# Altium project QCMI_SOM8MM.PrjPcb (part 2 of 3)

## Sheet 06-CPUCTL QCMI SOM.SchDoc: CPU MISC
size 431 x 279 mm; CAGE_CODE: 8LSW1; Designer: B. Jordan; DsnPath: G:\My Drive\Quilter Computer - Engineering Assets\NXP i.MX8M-Mini\8MMINILPD4-CPU2-DESIGNFILES\8MMINILPD4-CPU2-DESIGNFILES\SCH-47712_A4.DSN; ApprovedBy: S. Nesterenko; CheckedBy: D. Gudino; Author: B. Jordan; CompanyName: Allegro Labs, Inc.; DrawnBy: B. Jordan; Engineer: B. Jordan; Organization: QLTR; Address1: 29315 Stonecrest Rd; Address2: Rolling Hills Estates; Address3: CA, 90275; Address4: USA; DocumentNumber: QCMISM-SCH-06-0; Revision: 0; SheetNumber: 06; SheetTotal: 10; ENG_APP_DATE: --/--/--; DSN_APP_DATE: --/--/--; CHK_APP_DATE: --/--/--; DOC_NO_BOM: TBD; DOC_NO_ASSY_DWG: TBD; DOC_NO_FAB_DWG: TBD; DOC_NO_PCB_DWG: TBD
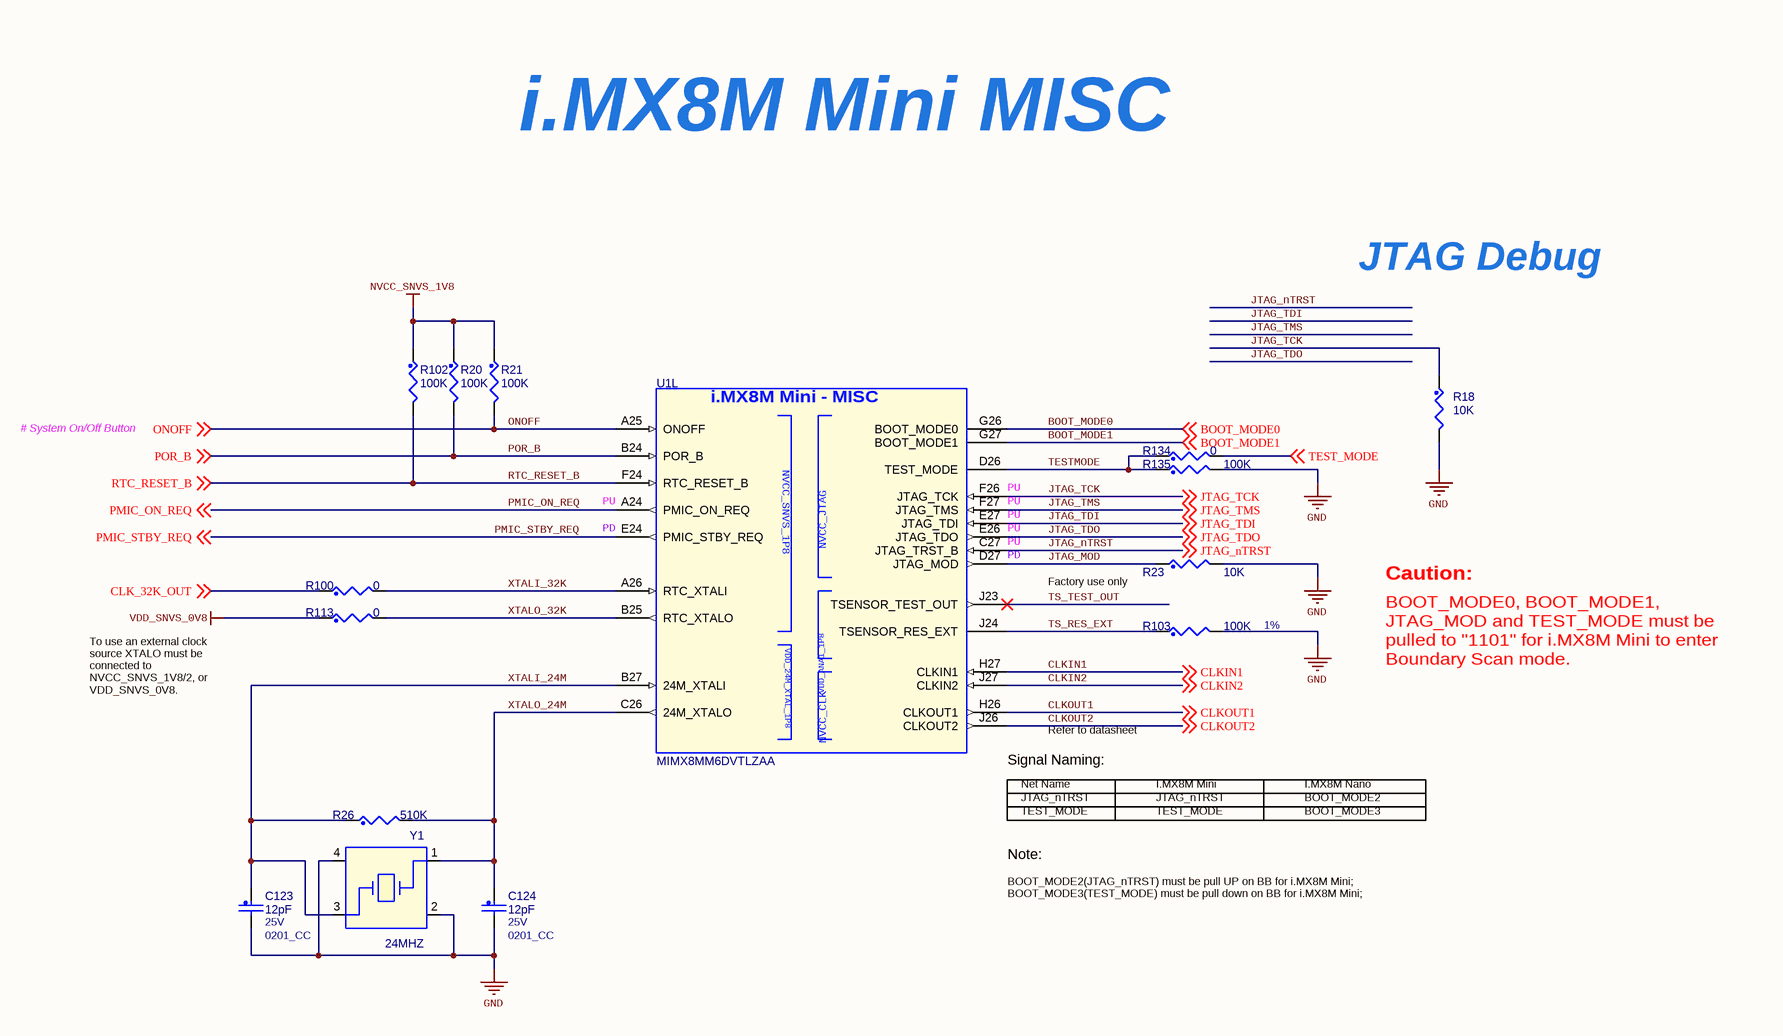
[diagram p5: 06-CPUCTL QCMI SOM.SchDoc]

### Parts
C123  12pF  VOLTAGE: 25V  [0201_CC]
C124  12pF  VOLTAGE: 25V  [0201_CC]
R18  10K  [0201_CC]
R20  100K  [0201_CC]
R21  100K  [0201_CC]
R23  10K  [0201_CC]
R26  510K  [0402_CC]
R100  0  [RC0402_25]
R102  100K  [0201_CC]
R103  100K  Tolerance: 1%  [0201_CC]
R113  0  [RC0402_25]
R134  0  [RC0402_25]
R135  100K  [0201_CC]
U1  MIMX8MM6DVTLZAA  [bga486_0p5_14x14]  (part L of 14)
Y1  24MHZ  [xtlosc4_3p2x2p5mm_sm]

### Nets
GND: C123.2 C124.2 R18.2 R23.2 R103.2 R135.2 Y1.2 Y1.4
NVCC_SNVS_1V8: R20.1 R21.1 R102.1
VDD_SNVS_0V8: R113.1
BOOT_MODE0: U1.G26(BOOT_MODE0) ; off-sheet BOOT_MODE0
BOOT_MODE1: U1.G27(BOOT_MODE1) ; off-sheet BOOT_MODE1
CLK_32K_OUT: R100.1 ; off-sheet CLK_32K_OUT
CLKIN1: U1.H27(CLKIN1) ; off-sheet CLKIN1
CLKIN2: U1.J27(CLKIN2) ; off-sheet CLKIN2
CLKOUT1: U1.H26(CLKOUT1) ; off-sheet CLKOUT1
CLKOUT2: U1.J26(CLKOUT2) ; off-sheet CLKOUT2
JTAG_MOD: R23.1 U1.D27(JTAG_MOD)
JTAG_nTRST: U1.C27(JTAG_TRST_B) ; off-sheet JTAG_nTRST
JTAG_TCK: R18.1 U1.F26(JTAG_TCK) ; off-sheet JTAG_TCK
JTAG_TDI: U1.E27(JTAG_TDI) ; off-sheet JTAG_TDI
JTAG_TDO: U1.E26(JTAG_TDO) ; off-sheet JTAG_TDO
JTAG_TMS: U1.F27(JTAG_TMS) ; off-sheet JTAG_TMS
ONOFF: R21.2 U1.A25(ONOFF) ; off-sheet ONOFF
PMIC_ON_REQ: U1.A24(PMIC_ON_REQ) ; off-sheet PMIC_ON_REQ
PMIC_STBY_REQ: U1.E24(PMIC_STBY_REQ) ; off-sheet PMIC_STBY_REQ
POR_B: R20.2 U1.B24(POR_B) ; off-sheet POR_B
RTC_RESET_B: R102.2 U1.F24(RTC_RESET_B) ; off-sheet RTC_RESET_B
TEST_MODE: R134.2 ; off-sheet TEST_MODE
TESTMODE: R134.1 R135.1 U1.D26(TEST_MODE)
TS_RES_EXT: R103.1 U1.J24(TSENSOR_RES_EXT)
TS_TEST_OUT: U1.J23(TSENSOR_TEST_OUT)
XTALI_24M: C123.1 R26.1 U1.B27(24M_XTALI) Y1.3
XTALI_32K: R100.2 U1.A26(RTC_XTALI)
XTALO_24M: C124.1 R26.2 U1.C26(24M_XTALO) Y1.1
XTALO_32K: R113.2 U1.B25(RTC_XTALO)

### Notes on the sheet
- i.MX8M Mini MISC
- JTAG Debug
- # System On/Off Button
- (near U1) PD
- (near U1) PU
- Factory use only
- Caution:
- BOOT_MODE0, BOOT_MODE1, JTAG_MOD and TEST_MODE must be pulled to "1101" for i.MX8M Mini to enter Boundary Scan mode.
- To use an external clock source XTALO must be connected to NVCC_SNVS_1V8/2, or VDD_SNVS_0V8.
- Refer to datasheet
- (near U1) Signal Naming:
- Net Name
- JTAG_nTRST
- I.MX8M Mini
- I.MX8M Nano
- BOOT_MODE2
- Note:
- TEST_MODE
- BOOT_MODE3
- BOOT_MODE2(JTAG_nTRST) must be pull UP on BB for i.MX8M Mini;
  BOOT_MODE3(TEST_MODE) must be pull down on BB for i.MX8M Mini;
- DWG. NO.
- REV.
- SHT.
- REVISION
- DESCRIPTION
- DATE
- APPROVED
- ENG:
- APPROVALS
- REFERENCE DOCUMENTS
- DSN:
- CHK:
- TITLE
- PROJECT
- BOM:
- ASSY DWG:
- FAB DWG:
- SIZE
- FILE NAME
- B
- SCHEMATIC DOCUMENT NUMBER
- SHEET
- OF
- REV
- PCB DWG:
- (in symbol MIMX8MM_BGA486P, part L) i.MX8M Mini - MISC; VDD_ANA1_1P8

### Library data of the parts
C123 = CAP_NP: CAP CER 12PF 25V 5% C0G AEC-Q200 0201; MFG_NAME01: TDK; MFG_PN01: CGA1A2C0G1E120J030BA; EIA Case: 0201; Temp Range: -55°C ~ 125°C; Value: 12pF; Tolerance: 5%; ROHS: Yes; PCB Footprint: 0201_CC
C124 = CAP_NP: CAP CER 12PF 25V 5% C0G AEC-Q200 0201; MFG_PN01: CGA1A2C0G1E120J030BA; MFG_NAME01: TDK; EIA Case: 0201; Temp Range: -55°C ~ 125°C; Value: 12pF; ROHS: Yes; Tolerance: 5%; PCB Footprint: 0201_CC
R18 = RES: RES MF 10K 1/20W 5% 0201; MFG_NAME01: RALEC ELECTRONIC CORP; MFG_PN01: RTT01103JTH; EIA Case: 0201; Temp Range: -55°C ~ 125°C; Value: 10K; Tolerance: 5%; ROHS: Yes; PCB Footprint: 0201_CC; Rated Power: 1/20W
R20 R21 R102 R103 = RES: RES MF 100K 1/20W 1% 0201; MFG_PN01: RC-0201-104FT; MFG_NAME01: SKYMOS; EIA Case: 0201; Temp Range: -55°C ~ 125°C; Value: 100K; ROHS: Yes; PCB Footprint: 0201_CC; Rated Power: 1/20W
  R20 R21 R102: Tolerance: 1%
R23 = RES: RES MF 10K 1/20W 5% 0201; MFG_PN01: RTT01103JTH; MFG_NAME01: RALEC ELECTRONIC CORP; EIA Case: 0201; Temp Range: -55°C ~ 125°C; Value: 10K; ROHS: Yes; Tolerance: 5%; PCB Footprint: 0201_CC; Rated Power: 1/20W
R26 = RES: RES MF 510K 1/16W 5% 0402; MFG_NAME01: PANASONIC; MFG_PN01: ERJ-2GEJ514X; EIA Case: 0402; Value: 510K; Tolerance: 5%; ROHS: Yes; PCB Footprint: 0402_CC; Rated Power: 1/16W
R100 = RES: RES MF ZERO OHM 1/16W 5% 0402; EIA Case: 0402; MFG_PN01: MCR01MZPJ000; MFG_NAME01: ROHM; Value: 0; ROHS: Yes; Tolerance: 5%; PCB Footprint: RC0402_25; Rated Power: 1/16W
R113 R134 = RES: RES MF ZERO OHM 1/16W 5% 0402; EIA Case: 0402; MFG_NAME01: ROHM; MFG_PN01: MCR01MZPJ000; Value: 0; Tolerance: 5%; ROHS: Yes; PCB Footprint: RC0402_25; Rated Power: 1/16W
R135 = RES: RES MF 100K 1/20W 1% 0201; MFG_NAME01: SKYMOS; MFG_PN01: RC-0201-104FT; EIA Case: 0201; Temp Range: -55°C ~ 125°C; Value: 100K; Tolerance: 1%; ROHS: Yes; PCB Footprint: 0201_CC; Rated Power: 1/20W
U1 = MIMX8MM_BGA486P: IC CPU QUAD CORTEX A53+M4 1.8GHZ BGA486; MFG_NAME01: NXP SEMICONDUCTORS; Value: MIMX8MM6DVTLZAA; MFG_PN01: MIMX8MM6DVTLZAA; ROHS: Yes; PCB Footprint: bga486_0p5_14x14; JEDEC Case: BGA486
Y1 = XTAL_13Y: XTAL 24MHZ 9pF -- SMT 3.2X2.5MM; MFG_PN01: TSX-3225 24.0000MF15X-AC3; MFG_NAME01: EPSON TOYOCOM CORPORATION; EIA Case: 3225 (Metric); Value: 24MHZ; ROHS: Yes; PCB Footprint: xtlosc4_3p2x2p5mm_sm

## Sheet 07-FLASH QCMI SOM.SchDoc: eMMC/QSPI
size 431 x 279 mm; CAGE_CODE: 8LSW1; Designer: B. Jordan; DsnPath: G:\My Drive\Quilter Computer - Engineering Assets\NXP i.MX8M-Mini\8MMINILPD4-CPU2-DESIGNFILES\8MMINILPD4-CPU2-DESIGNFILES\SCH-47712_A4.DSN; ApprovedBy: S. Nesterenko; CheckedBy: D. Gudino; Author: B. Jordan; CompanyName: Allegro Labs, Inc.; DrawnBy: B. Jordan; Engineer: B. Jordan; Organization: QLTR; Address1: 29315 Stonecrest Rd; Address2: Rolling Hills Estates; Address3: CA, 90275; Address4: USA; DocumentNumber: QCMISM-SCH-07-0; Revision: 0; SheetNumber: 07; SheetTotal: 10; ENG_APP_DATE: --/--/--; DSN_APP_DATE: --/--/--; CHK_APP_DATE: --/--/--; DOC_NO_BOM: TBD; DOC_NO_ASSY_DWG: TBD; DOC_NO_FAB_DWG: TBD; DOC_NO_PCB_DWG: TBD
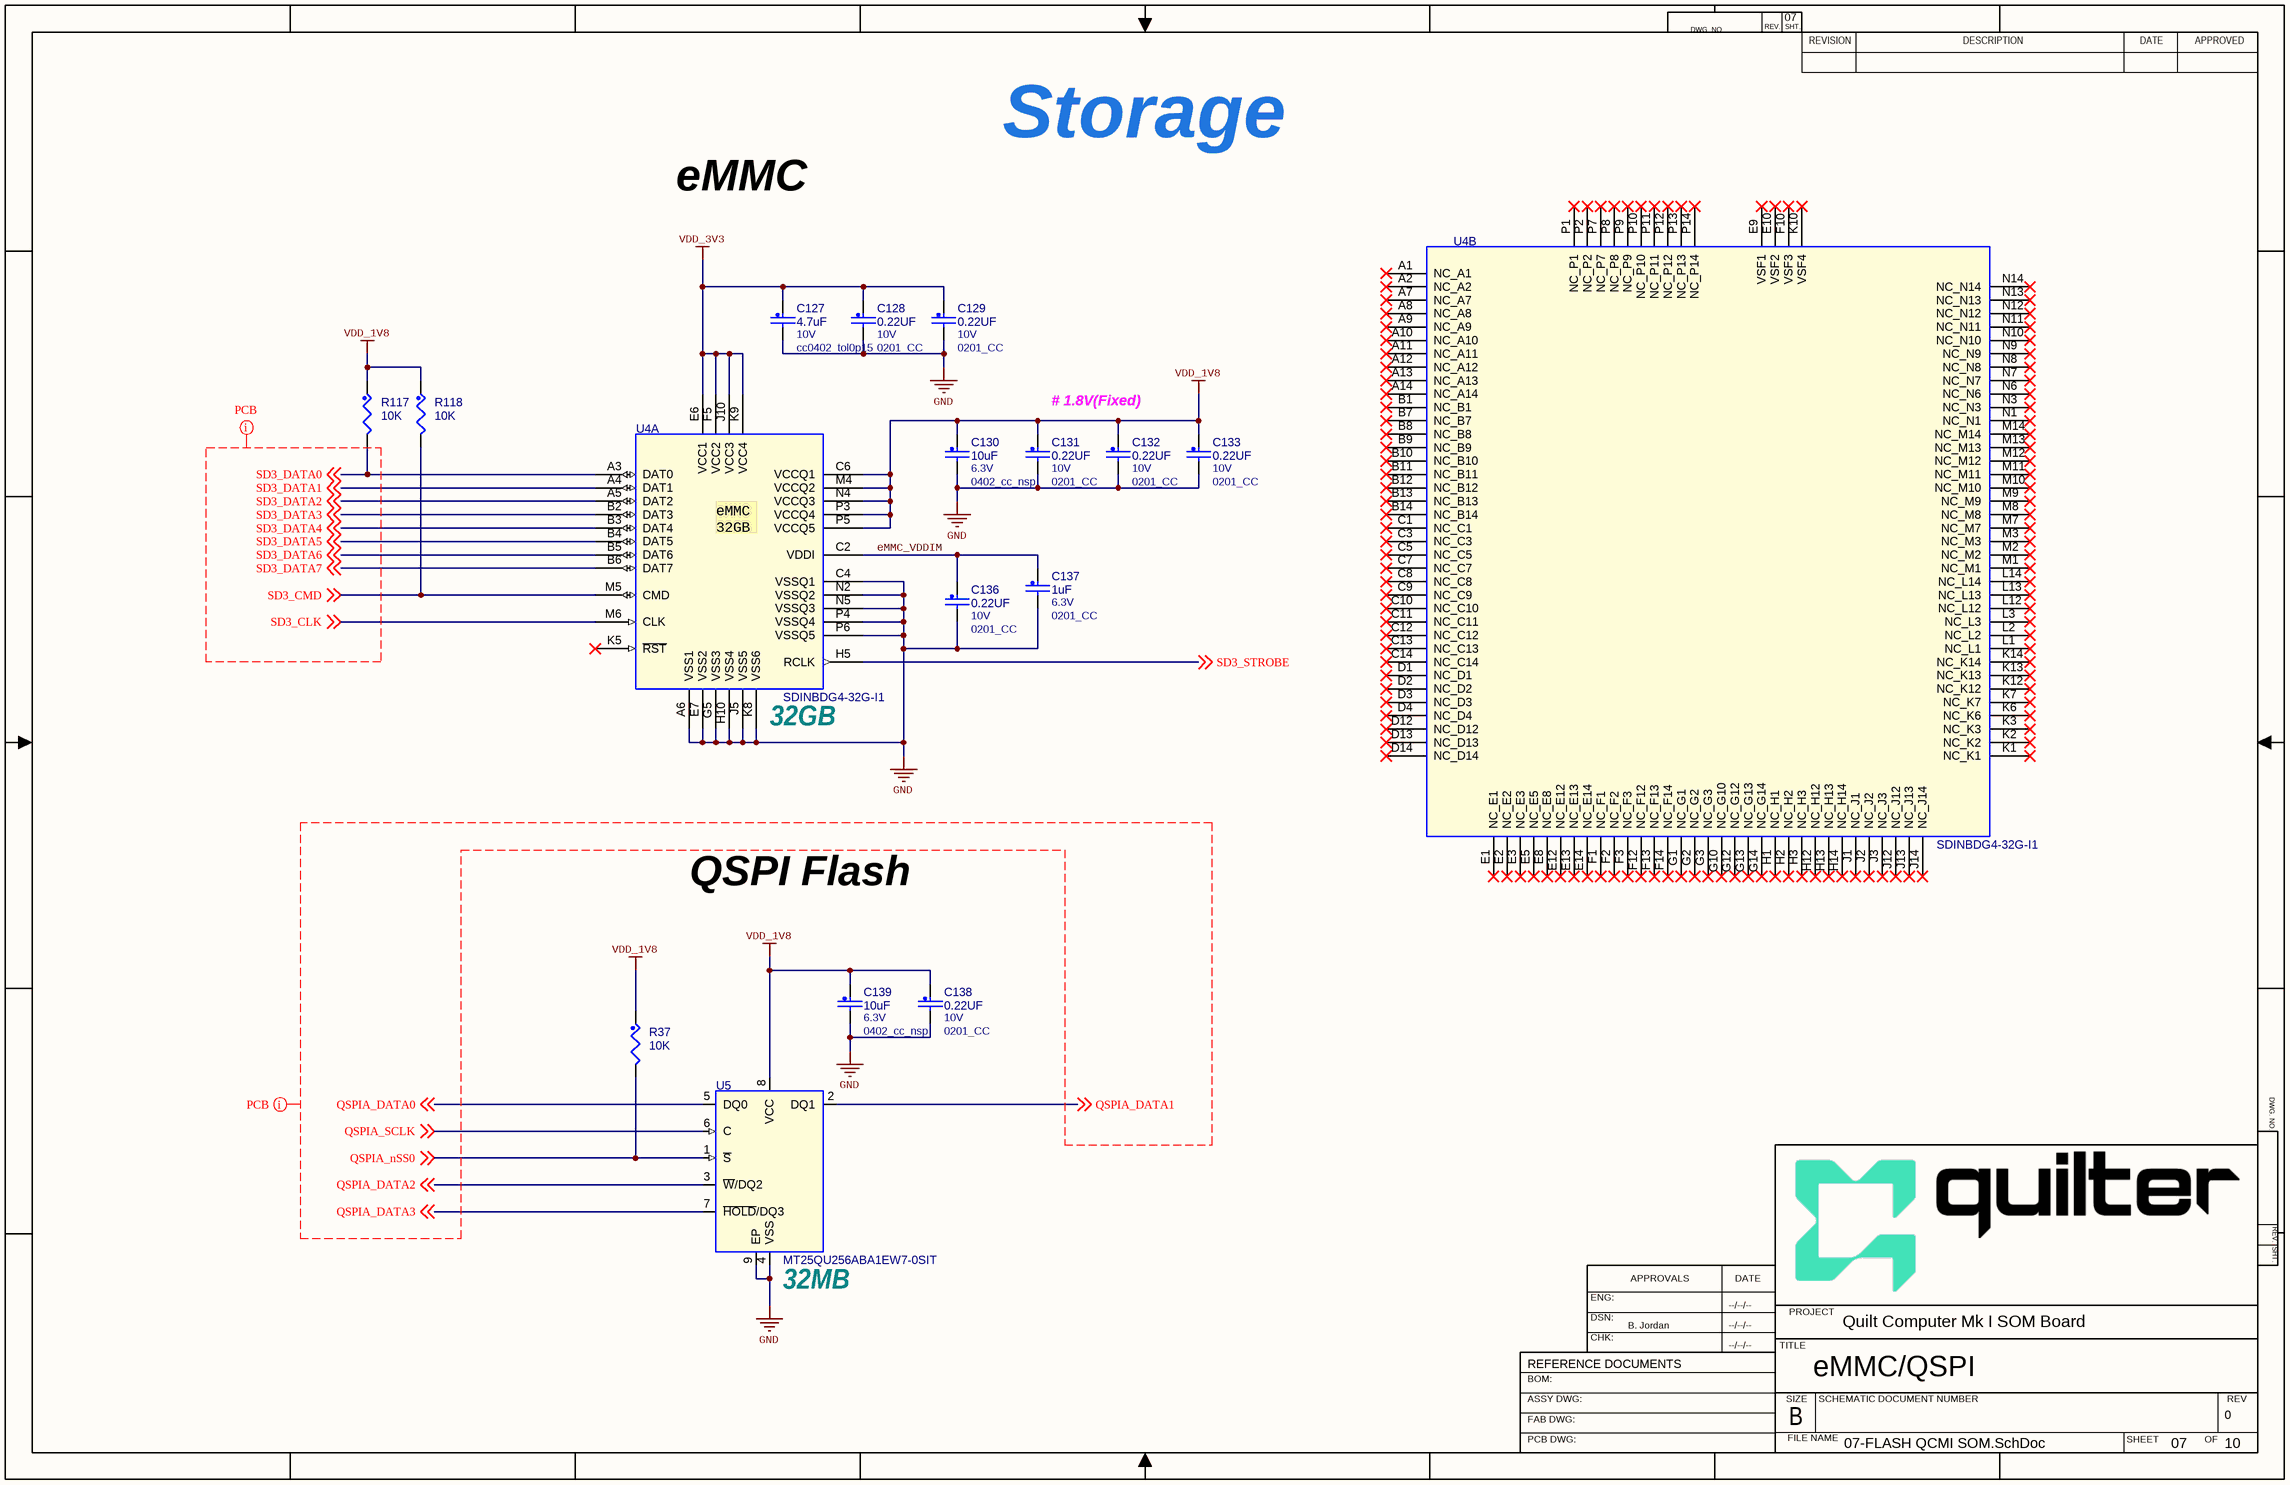
[diagram p6: 07-FLASH QCMI SOM.SchDoc]

### Parts
C127  4.7uF  VOLTAGE: 10V  [cc0402_tol0p15]
C128  0.22UF  VOLTAGE: 10V  [0201_CC]
C129  0.22UF  VOLTAGE: 10V  [0201_CC]
C130  10uF  VOLTAGE: 6.3V  [0402_cc_nsp]
C131  0.22UF  VOLTAGE: 10V  [0201_CC]
C132  0.22UF  VOLTAGE: 10V  [0201_CC]
C133  0.22UF  VOLTAGE: 10V  [0201_CC]
C136  0.22UF  VOLTAGE: 10V  [0201_CC]
C137  1uF  VOLTAGE: 6.3V  [0201_CC]
C138  0.22UF  VOLTAGE: 10V  [0201_CC]
C139  10uF  VOLTAGE: 6.3V  [0402_cc_nsp]
R37  10K  [0402_CC]
R117  10K  [0201_CC]
R118  10K  [0201_CC]
U4  SDINBDG4-32G-I1  [fbga153_0p5_11p5x13]  (parts A,B of 2)
U5  MT25QU256ABA1EW7-0SIT  [dfn8_1p27_6x5mm_3p1]

### Nets
GND: C127.2 C128.2 C129.2 C130.2 C131.2 C132.2 C133.2 C136.2 C137.2 C138.2 C139.2 U4.A6(VSS1) U4.C4(VSSQ1) U4.E7(VSS2) U4.G5(VSS3) U4.H10(VSS4) U4.J5(VSS5) U4.K8(VSS6) U4.N2(VSSQ2) U4.N5(VSSQ3) U4.P4(VSSQ4) U4.P6(VSSQ5) U5.4(VSS) U5.9(EP)
VDD_1V8: C130.1 C131.1 C132.1 C133.1 C138.1 C139.1 R37.1 R117.1 R118.1 U4.C6(VCCQ1) U4.M4(VCCQ2) U4.N4(VCCQ3) U4.P3(VCCQ4) U4.P5(VCCQ5) U5.8(VCC)
VDD_3V3: C127.1 C128.1 C129.1 U4.E6(VCC1) U4.F5(VCC2) U4.J10(VCC3) U4.K9(VCC4)
eMMC_VDDIM: C136.1 C137.1 U4.C2(VDDI)
QSPIA_DATA0: U5.5(DQ0) ; off-sheet QSPIA_DATA0
QSPIA_DATA1: U5.2(DQ1) ; off-sheet QSPIA_DATA1
QSPIA_DATA2: U5.3(~{W}/DQ2) ; off-sheet QSPIA_DATA2
QSPIA_DATA3: U5.7(~{HOLD}/DQ3) ; off-sheet QSPIA_DATA3
QSPIA_nSS0: R37.2 U5.1(~{S}) ; off-sheet QSPIA_nSS0
QSPIA_SCLK: U5.6(C) ; off-sheet QSPIA_SCLK
SD3_CLK: U4.M6(CLK) ; off-sheet SD3_CLK
SD3_CMD: R118.2 U4.M5(CMD) ; off-sheet SD3_CMD
SD3_DATA0: R117.2 U4.A3(DAT0) ; off-sheet SD3_DATA0
SD3_DATA1: U4.A4(DAT1) ; off-sheet SD3_DATA1
SD3_DATA2: U4.A5(DAT2) ; off-sheet SD3_DATA2
SD3_DATA3: U4.B2(DAT3) ; off-sheet SD3_DATA3
SD3_DATA4: U4.B3(DAT4) ; off-sheet SD3_DATA4
SD3_DATA5: U4.B4(DAT5) ; off-sheet SD3_DATA5
SD3_DATA6: U4.B5(DAT6) ; off-sheet SD3_DATA6
SD3_DATA7: U4.B6(DAT7) ; off-sheet SD3_DATA7
SD3_STROBE: U4.H5(RCLK) ; off-sheet SD3_STROBE

Not connected (* = marked no-connect by the designer): U4 A1(NC_A1)* A2(NC_A2)* A7(NC_A7)* A8(NC_A8)* A9(NC_A9)* A10(NC_A10)* A11(NC_A11)* A12(NC_A12)* A13(NC_A13)* A14(NC_A14)* B1(NC_B1)* B7(NC_B7)* B8(NC_B8)* B9(NC_B9)* B10(NC_B10)* B11(NC_B11)* B12(NC_B12)* B13(NC_B13)* B14(NC_B14)* C1(NC_C1)* C3(NC_C3)* C5(NC_C5)* C7(NC_C7)* C8(NC_C8)* C9(NC_C9)* C10(NC_C10)* C11(NC_C11)* C12(NC_C12)* C13(NC_C13)* C14(NC_C14)* D1(NC_D1)* D2(NC_D2)* D3(NC_D3)* D4(NC_D4)* D12(NC_D12)* D13(NC_D13)* D14(NC_D14)* E1(NC_E1)* E2(NC_E2)* E3(NC_E3)* E5(NC_E5)* E8(NC_E8)* E9(VSF1)* E10(VSF2)* E12(NC_E12)* E13(NC_E13)* E14(NC_E14)* F1(NC_F1)* F2(NC_F2)* F3(NC_F3)* F10(VSF3)* F12(NC_F12)* F13(NC_F13)* F14(NC_F14)* G1(NC_G1)* G2(NC_G2)* G3(NC_G3)* G10(NC_G10)* G12(NC_G12)* G13(NC_G13)* G14(NC_G14)* H1(NC_H1)* H2(NC_H2)* H3(NC_H3)* H12(NC_H12)* H13(NC_H13)* H14(NC_H14)* J1(NC_J1)* J2(NC_J2)* J3(NC_J3)* J12(NC_J12)* J13(NC_J13)* J14(NC_J14)* K1(NC_K1)* K2(NC_K2)* K3(NC_K3)* K5(~{RST})* K6(NC_K6)* K7(NC_K7)* K10(VSF4)* K12(NC_K12)* K13(NC_K13)* K14(NC_K14)* L1(NC_L1)* L2(NC_L2)* L3(NC_L3)* L12(NC_L12)* L13(NC_L13)* L14(NC_L14)* M1(NC_M1)* M2(NC_M2)* M3(NC_M3)* M7(NC_M7)* M8(NC_M8)* M9(NC_M9)* M10(NC_M10)* M11(NC_M11)* M12(NC_M12)* M13(NC_M13)* M14(NC_M14)* N1(NC_N1)* N3(NC_N3)* N6(NC_N6)* N7(NC_N7)* N8(NC_N8)* N9(NC_N9)* N10(NC_N10)* N11(NC_N11)* N12(NC_N12)* N13(NC_N13)* N14(NC_N14)* P1(NC_P1)* P2(NC_P2)* P7(NC_P7)* P8(NC_P8)* P9(NC_P9)* P10(NC_P10)* P11(NC_P11)* P12(NC_P12)* P13(NC_P13)* P14(NC_P14)*

### Layout directives
net class EMMC_SD3; rule Matched Net Lengths [Delay Tolerance = 100ps]: SD3_CLK, SD3_CMD, SD3_DATA0, SD3_DATA1, SD3_DATA2, SD3_DATA3, SD3_DATA4, SD3_DATA5, SD3_DATA6, SD3_DATA7
net class QSPI; rule Matched Net Lengths [Delay Tolerance = 100ps]: QSPIA_DATA0, QSPIA_DATA1, QSPIA_DATA2, QSPIA_DATA3, QSPIA_nSS0, QSPIA_SCLK

### Notes on the sheet
- Storage
- eMMC
- # 1.8V(Fixed)
- (near U4) 32GB
- QSPI Flash
- (near U5) 32MB
- DWG. NO.
- REV.
- SHT.
- REVISION
- DESCRIPTION
- DATE
- APPROVED
- ENG:
- APPROVALS
- REFERENCE DOCUMENTS
- DSN:
- CHK:
- TITLE
- PROJECT
- BOM:
- ASSY DWG:
- FAB DWG:
- SIZE
- FILE NAME
- B
- SCHEMATIC DOCUMENT NUMBER
- SHEET
- OF
- REV
- PCB DWG:
- (in symbol SDINBDG4-16G_VFBGA_153P, part A) eMMC / 32GB

### Library data of the parts
C127 = CAP_NP: CAP CER 4.7uF 10V 10% X5R 0402; MFG_NAME01: SAMSUNG ELECTRO MECHANICS; MFG_PN01: CL05A475KP5NRNC; EIA Case: 0402; Temp Range: -55°C ~ 125°C; Value: 4.7uF; Tolerance: 10%; ROHS: Yes; PCB Footprint: cc0402_tol0p15
C128 C131-C133 = CAP_NP: CAP CER 0.22UF 10V 20% X5R 0201; MFG_NAME01: Taiyo Yuden; MFG_PN01: LMK063BJ224MP-F; EIA Case: 0201; Temp Range: -55°C ~ 125°C; Value: 0.22UF; PCB Footprint: 0201_CC; Tolerance: 20%; ROHS: Yes
C129 C136 C138 = CAP_NP: CAP CER 0.22UF 10V 20% X5R 0201; MFG_PN01: LMK063BJ224MP-F; MFG_NAME01: Taiyo Yuden; EIA Case: 0201; Temp Range: -55°C ~ 125°C; Value: 0.22UF; PCB Footprint: 0201_CC; ROHS: Yes; Tolerance: 20%
C130 = CAP_NP: CAP CER 10UF 6.3V 20% X5R 0402; MFG_NAME01: SAMSUNG ELECTRO MECHANICS; MFG_PN01: CL05A106MQ5NUNC; EIA Case: 0402; Temp Range: -55°C ~ 125°C; Value: 10uF; Tolerance: 20%; ROHS: Yes; PCB Footprint: 0402_cc_nsp
C137 = CAP_NP: CAP CER 1uF 6.3V 20% X5R 0201; MFG_NAME01: AVX; MFG_PN01: 02016D105MAT2A; EIA Case: 0201; Temp Range: -55°C ~ 125°C; Value: 1uF; PCB Footprint: 0201_CC; Tolerance: 20%; ROHS: Yes
C139 = CAP_NP: CAP CER 10UF 6.3V 20% X5R 0402; MFG_PN01: CL05A106MQ5NUNC; MFG_NAME01: SAMSUNG ELECTRO MECHANICS; EIA Case: 0402; Temp Range: -55°C ~ 125°C; Value: 10uF; ROHS: Yes; Tolerance: 20%; PCB Footprint: 0402_cc_nsp
R37 = RES: RES MF 10K 1/16W 5% 0402; MFG_NAME01: VISHAY INTERTECHNOLOGY; MFG_PN01: CRCW040210K0JNED; EIA Case: 0402; Value: 10K; PCB Footprint: 0402_CC; Tolerance: 5%; ROHS: Yes; Rated Power: 1/16W
R117 R118 = RES: RES MF 10K 1/20W 5% 0201; MFG_PN01: RTT01103JTH; MFG_NAME01: RALEC ELECTRONIC CORP; EIA Case: 0201; Value: 10K; PCB Footprint: 0201_CC; ROHS: Yes; Tolerance: 5%; Rated Power: 1/20W
U4 = SDINBDG4-16G_VFBGA_153P: IC MEM NAND FLASH 32GB eMMC 5.1 CTLR 2.7-3.6V FBGA153; EIA Case: 11.5 mm x 13 mm x 1 mm; Temp Range: -25°C ~ 85°C; MFG_NAME01: SanDisk; JEDEC Case: BGA153; Value: SDINBDG4-32G-I1; PCB Footprint: fbga153_0p5_11p5x13; ROHS: YES; VOLTAGE: 2.7-3.6V; MFG_PN01: SDINBDG4-32G-I1
U5 = MT25QL256ABA1EW9_9P: IC MEM FLASH SERIAL NOR 256MBIT 166MHZ 1.7-2V WPDFN8; MFG_NAME01: MICRON; Value: MT25QU256ABA1EW7-0SIT; PCB Footprint: dfn8_1p27_6x5mm_3p1; MFG_PN01: MT25QU256ABA1EW7-0SIT; ROHS: Yes; VOLTAGE: 1.7-2V

## Sheet 08-BOOTCFG QMCI SOM.SchDoc: BOOT_CFG
size 558 x 431 mm; CAGE_CODE: 8LSW1; Designer: B. Jordan; DsnPath: G:\My Drive\Quilter Computer - Engineering Assets\NXP i.MX8M-Mini\8MMINILPD4-CPU2-DESIGNFILES\8MMINILPD4-CPU2-DESIGNFILES\SCH-47712_A4.DSN; ApprovedBy: S. Nesterenko; CheckedBy: D. Gudino; Author: B. Jordan; CompanyName: Allegro Labs, Inc.; DrawnBy: B. Jordan; Engineer: B. Jordan; Address1: 29315 Stonecrest Rd; Address2: Rolling Hills Estates; Address3: CA, 90275; Address4: USA; DocumentNumber: QCMISM-SCH-08-0; Revision: 0; SheetNumber: 08; SheetTotal: 10; CHK_APP_DATE: --/--/--; DSN_APP_DATE: --/--/--; ENG_APP_DATE: --/--/--; DOC_NO_BOM: TBD; DOC_NO_ASSY_DWG: TBD; DOC_NO_FAB_DWG: TBD; DOC_NO_PCB_DWG: TBD
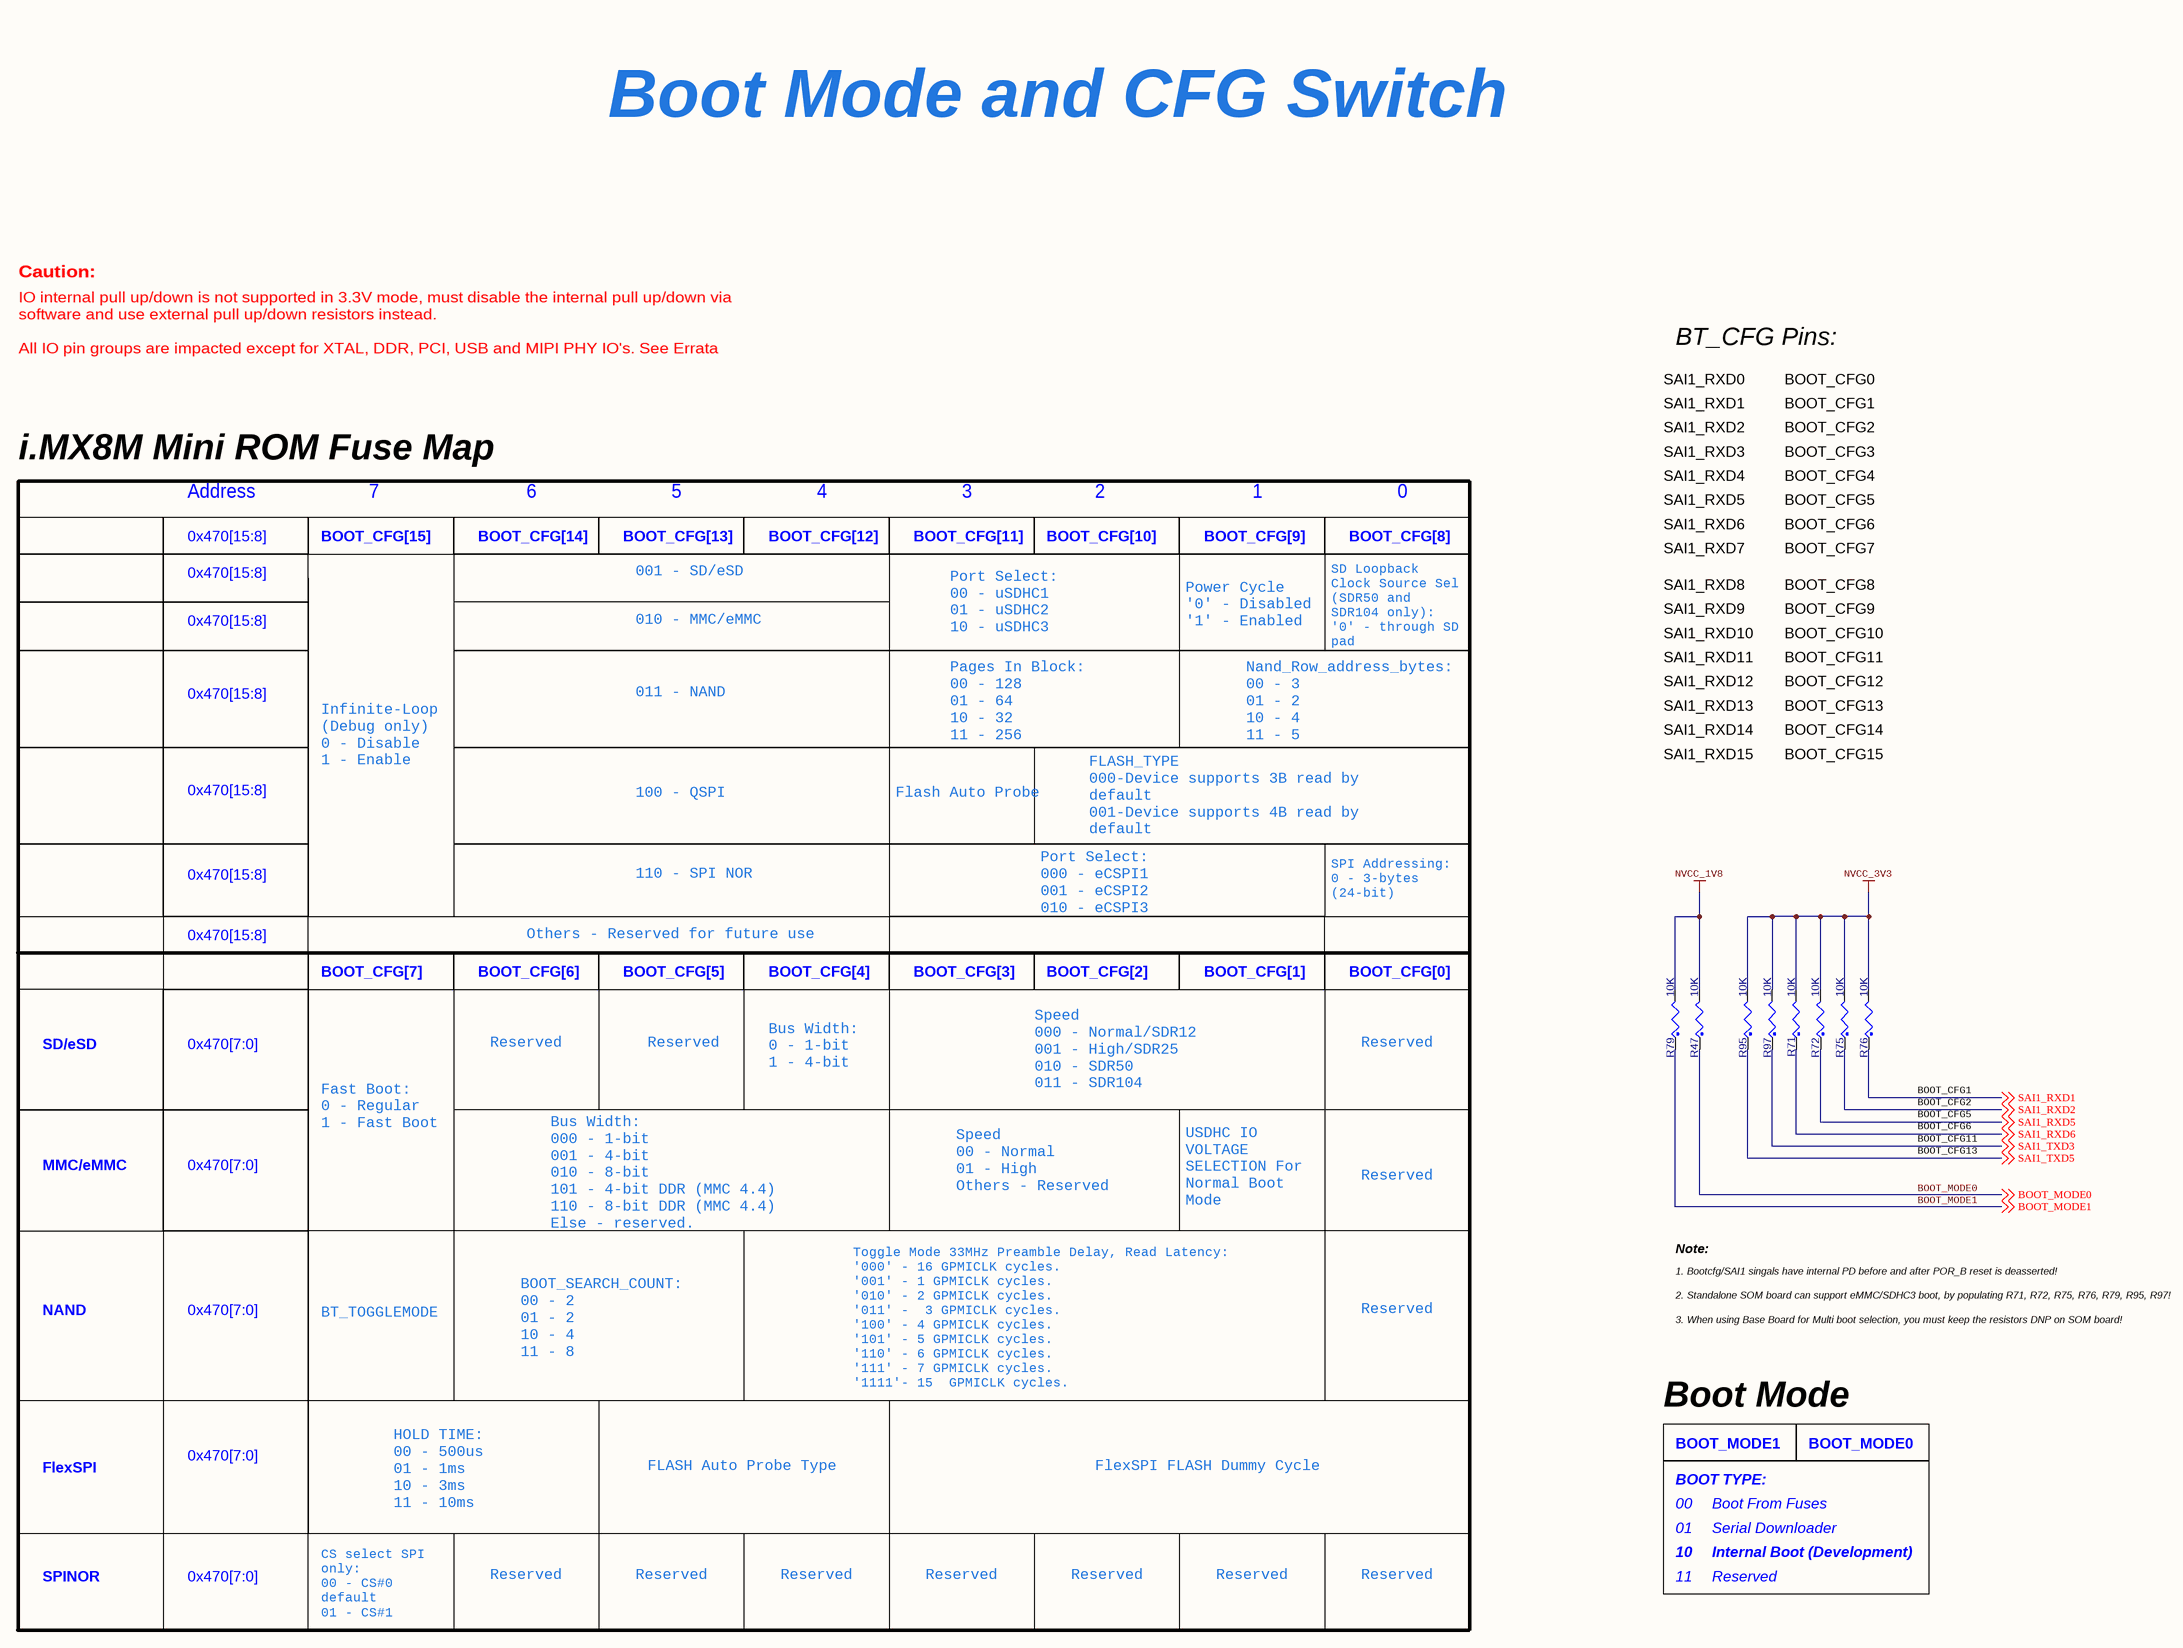
[diagram p7: 08-BOOTCFG QMCI SOM.SchDoc]

### Parts
R47  10K  [0402_CC]
R71  10K  [0402_CC]
R72  10K  [0402_CC]
R75  10K  [0402_CC]
R76  10K  [0402_CC]
R79  10K  [0402_CC]
R95  10K  [0402_CC]
R97  10K  [0402_CC]

### Nets
NVCC_1V8: R47.2 R79.2  [project net VDD_1V8]
NVCC_3V3: R71.2 R72.2 R75.2 R76.2 R95.2 R97.2  [project net VDD_3V3]
BOOT_MODE0: R47.1 ; off-sheet BOOT_MODE0
BOOT_MODE1: R79.1 ; off-sheet BOOT_MODE1
SAI1_RXD1: R76.1 ; off-sheet SAI1_RXD1
SAI1_RXD2: R75.1 ; off-sheet SAI1_RXD2
SAI1_RXD5: R72.1 ; off-sheet SAI1_RXD5
SAI1_RXD6: R71.1 ; off-sheet SAI1_RXD6
SAI1_TXD3: R97.1 ; off-sheet SAI1_TXD3
SAI1_TXD5: R95.1 ; off-sheet SAI1_TXD5

### Notes on the sheet
- Boot Mode and CFG Switch
- Caution:
- IO internal pull up/down is not supported in 3.3V mode, must disable the internal pull up/down via software and use external pull up/down resistors instead.
  All IO pin groups are impacted except for XTAL, DDR, PCI, USB and MIPI PHY IO's. See Errata e50080 for detailed information.
- BT_CFG Pins:
- SAI1_RXD0
- SAI1_RXD1
- BOOT_CFG0
- BOOT_CFG1
- i.MX8M Mini ROM Fuse Map
- SAI1_RXD2
- SAI1_RXD3
- SAI1_RXD4
- BOOT_CFG2
- BOOT_CFG3
- BOOT_CFG4
- 0x470[15:8]
- Address
- BOOT_CFG[15]
- 7
- BOOT_CFG[14]
- 6
- BOOT_CFG[13]
- 5
- BOOT_CFG[12]
- 4
- BOOT_CFG[11]
- 3
- BOOT_CFG[10]
- 2
- BOOT_CFG[9]
- 1
- BOOT_CFG[8]
- 0
- SAI1_RXD5
- SAI1_RXD6
- BOOT_CFG5
- BOOT_CFG6
- 001 - SD/eSD
- SAI1_RXD7
- SAI1_RXD8
- BOOT_CFG7
- BOOT_CFG8
- 010 - MMC/eMMC
- Port Select:
  00 - uSDHC1
  01 - uSDHC2
  10 - uSDHC3
- Power Cycle
  '0' - Disabled
  '1' - Enabled
- SD Loopback Clock Source Sel (SDR50 and SDR104 only):
  '0' - through SD pad
  '1' -  direct
- SAI1_RXD9
- SAI1_RXD10
- SAI1_RXD11
- BOOT_CFG9
- BOOT_CFG10
- BOOT_CFG11
- 011 - NAND
- SAI1_RXD12
- SAI1_RXD13
- BOOT_CFG12
- BOOT_CFG13
- Infinite-Loop
  (Debug only)
  0 - Disable
  1 - Enable
- Pages In Block:
  00 - 128
  01 - 64
  10 - 32
  11 - 256
- Nand_Row_address_bytes:
  00 - 3
  01 - 2
  10 - 4
  11 - 5
- SAI1_RXD14
- SAI1_RXD15
- BOOT_CFG14
- BOOT_CFG15
- 100 - QSPI
- Flash Auto Probe
- FLASH_TYPE
  000-Device supports 3B read by default
  001-Device supports 4B read by default
  010-HyperFlash 1V8
  011-HyperFlash 3V3
  100-MXIC Octal DDR
- 110 - SPI NOR
- Others - Reserved for future use
- Port Select:
  000 - eCSPI1
  001 - eCSPI2
  010 - eCSPI3
- SPI Addressing:
  0 - 3-bytes (24-bit)
  1 - 2-bytes (16-bit)
- BOOT_CFG[7]
- BOOT_CFG[6]
- BOOT_CFG[5]
- BOOT_CFG[4]
- BOOT_CFG[3]
- BOOT_CFG[2]
- BOOT_CFG[1]
- BOOT_CFG[0]
- SD/eSD
- 0x470[7:0]
- Reserved
- Bus Width:
  0 - 1-bit
  1 - 4-bit
- Speed
  000 - Normal/SDR12
  001 - High/SDR25
  010 - SDR50
  011 - SDR104
  Others - Reserved
- Fast Boot:
  0 - Regular
  1 - Fast Boot
- MMC/eMMC
- Bus Width:
  000 - 1-bit
  001 - 4-bit
  010 - 8-bit
  101 - 4-bit DDR (MMC 4.4)
  110 - 8-bit DDR (MMC 4.4)
  Else - reserved.
- Speed
  00 - Normal
  01 - High
  Others - Reserved
- USDHC IO VOLTAGE
  SELECTION For
  Normal Boot Mode
  0 - 3.3V
  1 - 1.8V
- Note:
- NAND
- BT_TOGGLEMODE
- 1. Bootcfg/SAI1 singals have internal PD before and after POR_B reset is deasserted!
- 2. Standalone SOM board can support eMMC/SDHC3 boot, by populating R71, R72, R75, R76, R79, R95, R97!
- 3. When using Base Board for Multi boot selection, you must keep the resistors DNP on SOM board!
- BOOT_SEARCH_COUNT:
  00 - 2
  01 - 2
  10 - 4
  11 - 8
- Toggle Mode 33MHz Preamble Delay, Read Latency:
  '000' - 16 GPMICLK cycles.
  '001' - 1 GPMICLK cycles.
  '010' - 2 GPMICLK cycles.
  '011' -  3 GPMICLK cycles.
  '100' - 4 GPMICLK cycles.
  '101' - 5 GPMICLK cycles.
  '110' - 6 GPMICLK cycles.
  '111' - 7 GPMICLK cycles.
  '1111'- 15  GPMICLK cycles.
- Boot Mode
- BOOT_MODE1
- BOOT_MODE0
- FlexSPI
- FLASH Auto Probe Type
- FlexSPI FLASH Dummy Cycle
- 00
- BOOT TYPE:
- Boot From Fuses
- HOLD TIME:
  00 - 500us
  01 - 1ms
  10 - 3ms
  11 - 10ms
- 01
- 10
- Serial Downloader
- Internal Boot (Development)
- SPINOR
- CS select SPI only:
  00 - CS#0  default
  01 - CS#1
  10 - CS#2
  11 - CS#3
- 11
- DWG. NO.
- REV.
- SHT.
- REVISION
- DESCRIPTION
- DATE
- APPROVED
- ENG:
- DSN:
- APPROVALS
- PROJECT
- REFERENCE DOCUMENTS
- BOM:
- CHK:
- TITLE
- ASSY DWG:
- FAB DWG:
- PCB DWG:
- SIZE
- FILE NAME
- C
- SCHEMATIC DOCUMENT NUMBER
- SHEET
- OF
- REV

### Library data of the parts
R47 R71 R75 = RES: RES MF 10K 1/16W 5% 0402; MFG_PN01: CRCW040210K0JNED; MFG_NAME01: VISHAY INTERTECHNOLOGY; EIA Case: 0402; Value: 10K; PCB Footprint: 0402_CC; ROHS: Yes; Tolerance: 5%; Rated Power: 1/16W
R72 R76 R79 R95 R97 = RES: as R37 on sheet 07-FLASH QCMI SOM; Value: 10K; PCB Footprint: 0402_CC; Tolerance: 5%; ROHS: Yes; Rated Power: 1/16W

## Sheet 09-PMIC QCMI SOM.SchDoc: PMIC
size 558 x 431 mm; CAGE_CODE: 8LSW1; Designer: B. Jordan; DsnPath: G:\My Drive\Quilter Computer - Engineering Assets\NXP i.MX8M-Mini\8MMINILPD4-CPU2-DESIGNFILES\8MMINILPD4-CPU2-DESIGNFILES\SCH-47712_A4.DSN; ApprovedBy: S. Nesterenko; CheckedBy: D. Gudino; Author: B. Jordan; CompanyName: Allegro Labs, Inc.; DrawnBy: B. Jordan; Engineer: B. Jordan; Address1: 29315 Stonecrest Rd; Address2: Rolling Hills Estates; Address3: CA, 90275; Address4: USA; DocumentNumber: QCMISM-SCH-09-0; Revision: 0; SheetNumber: 09; SheetTotal: 10; CHK_APP_DATE: --/--/--; DSN_APP_DATE: --/--/--; ENG_APP_DATE: --/--/--; DOC_NO_BOM: TBD; DOC_NO_ASSY_DWG: TBD; DOC_NO_FAB_DWG: TBD; DOC_NO_PCB_DWG: TBD
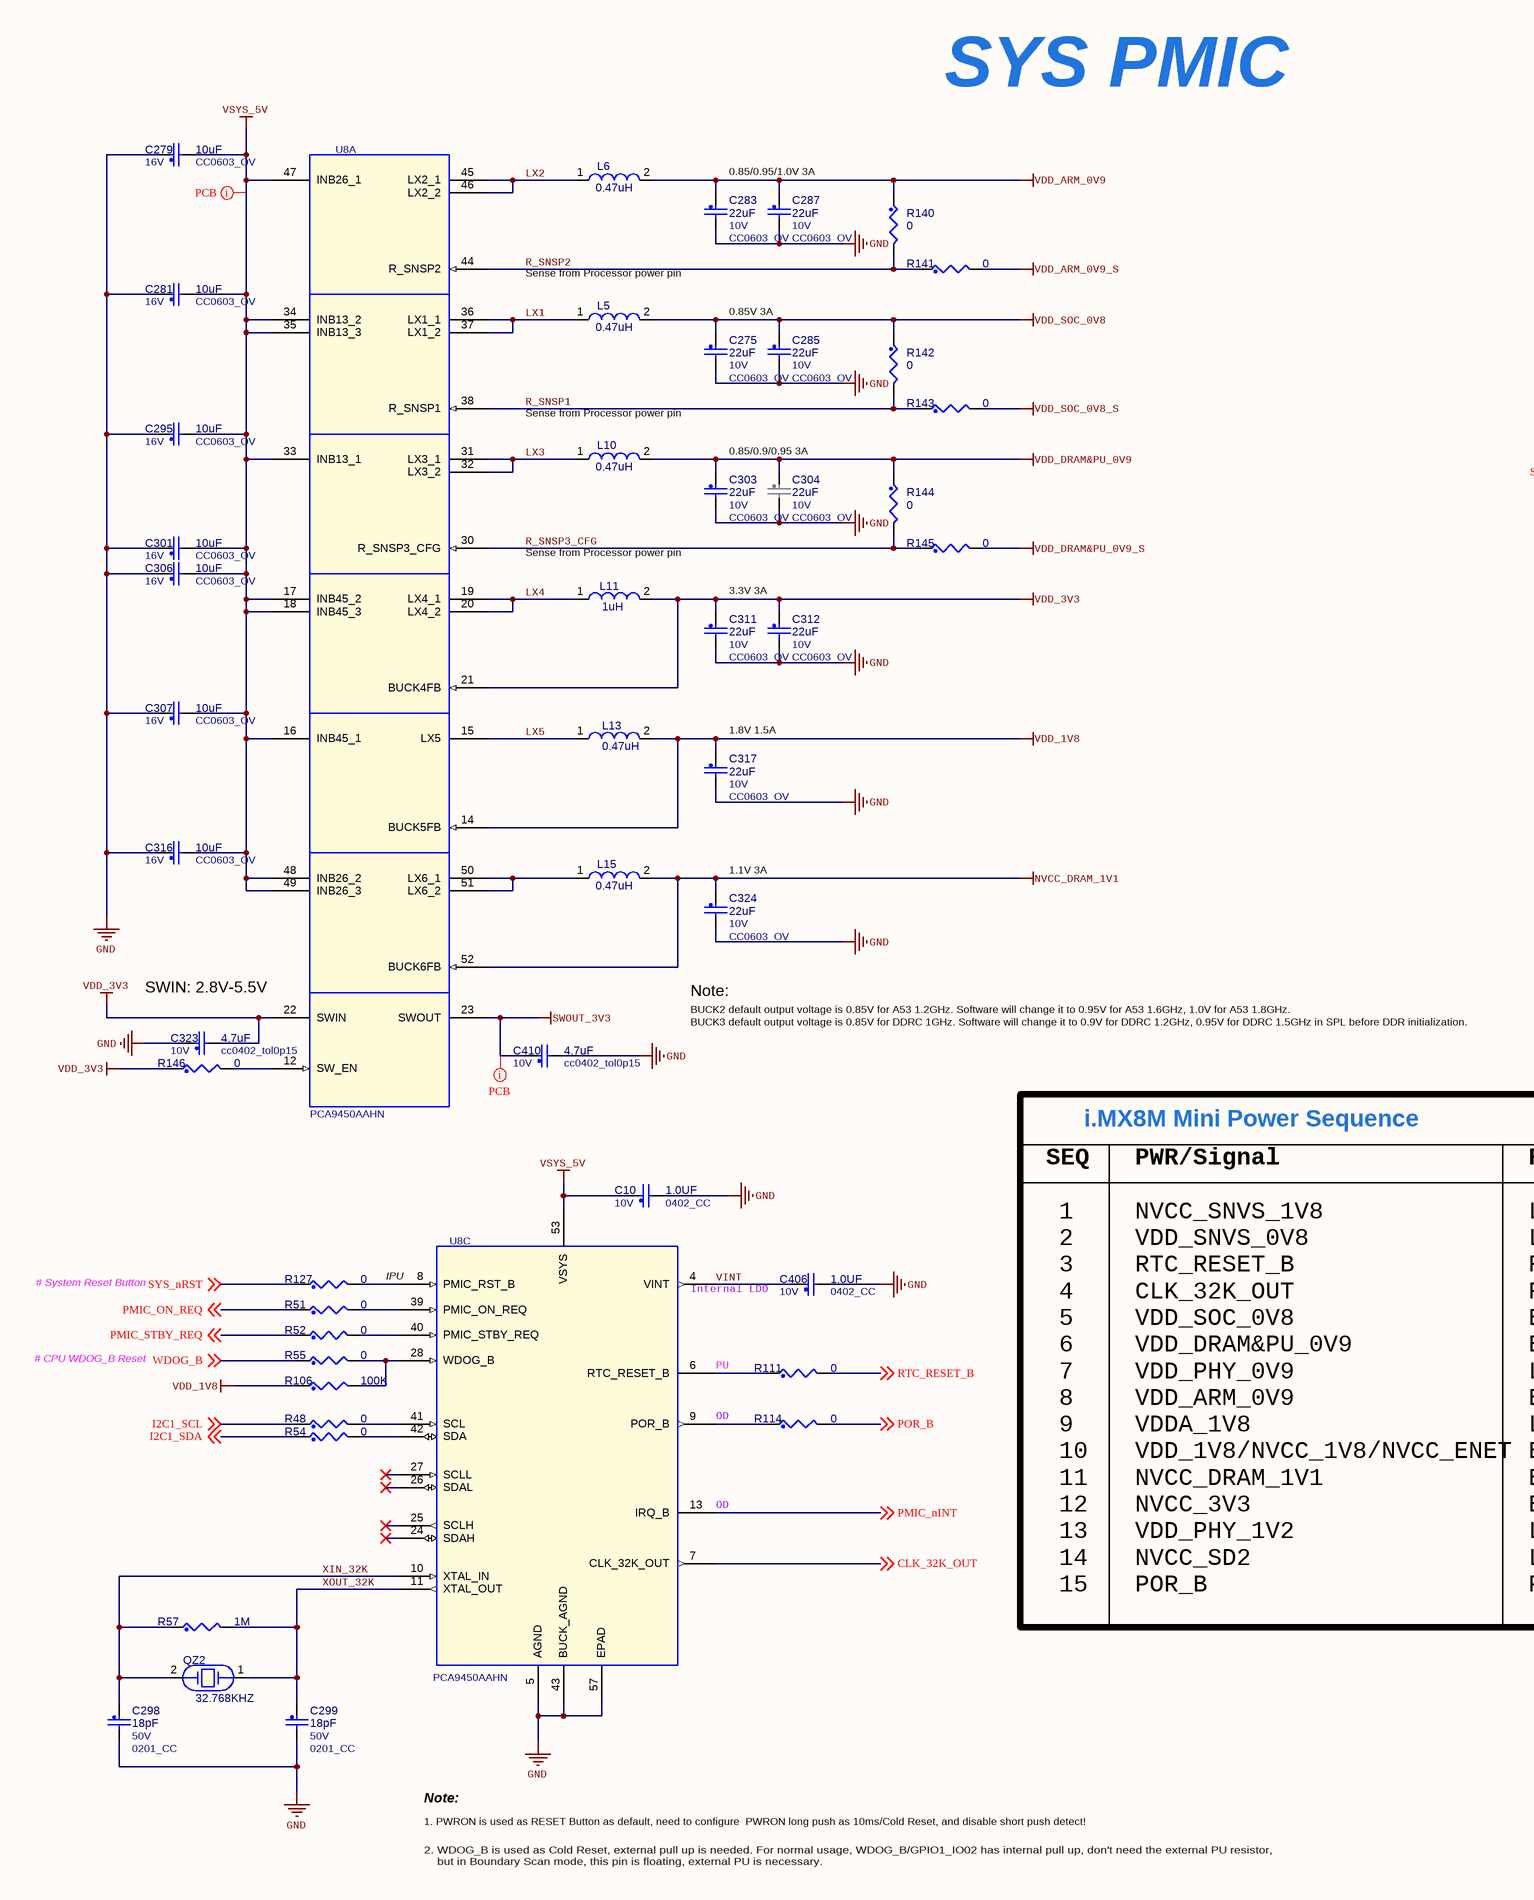
[diagram p8: 09-PMIC QCMI SOM.SchDoc, left]
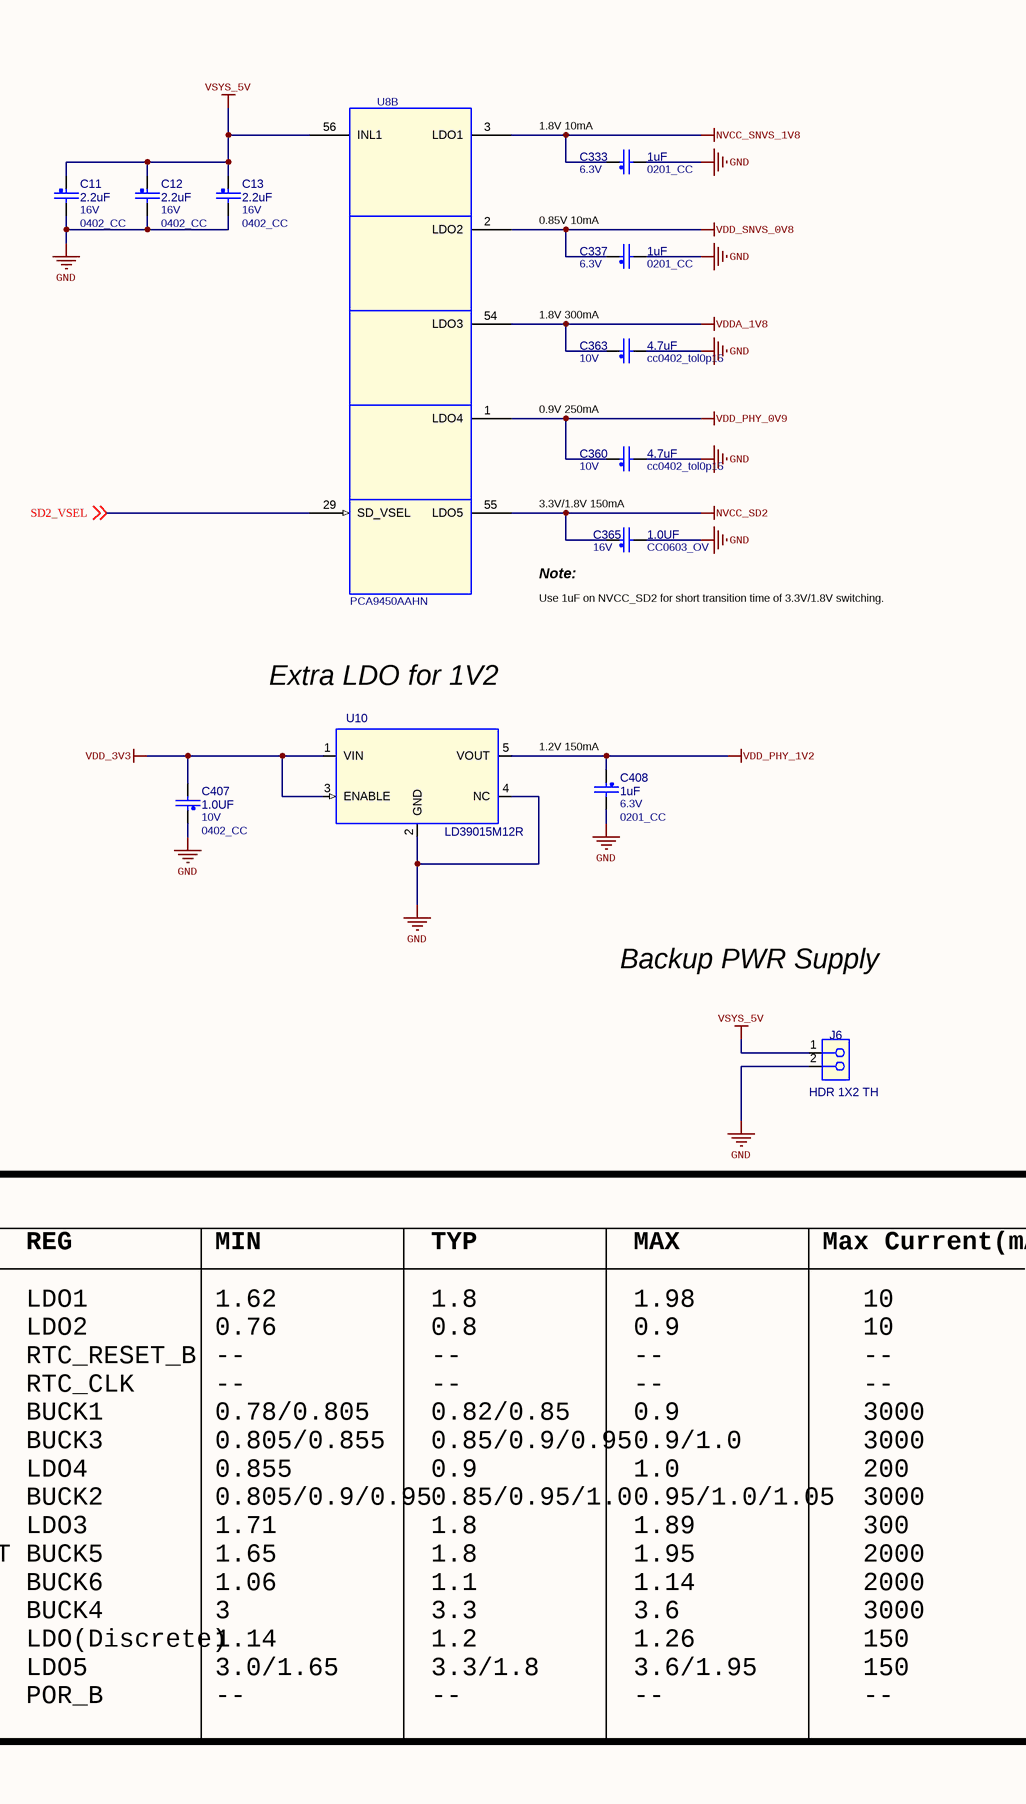
[diagram p9: 09-PMIC QCMI SOM.SchDoc, middle]
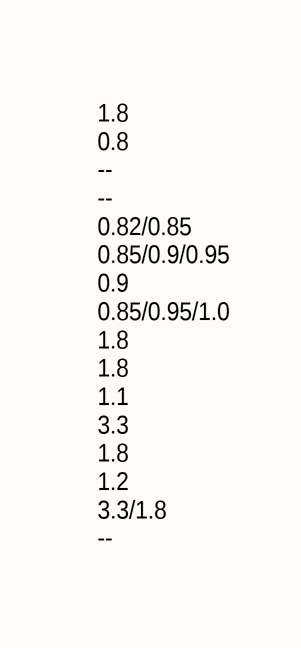
[diagram p10: 09-PMIC QCMI SOM.SchDoc, right]

### Parts
C10  1.0UF  VOLTAGE: 10V  [0402_CC]
C11  2.2uF  VOLTAGE: 16V  [0402_CC]
C12  2.2uF  VOLTAGE: 16V  [0402_CC]
C13  2.2uF  VOLTAGE: 16V  [0402_CC]
C275  22uF  VOLTAGE: 10V  [CC0603_OV]
C279  10uF  VOLTAGE: 16V  [CC0603_OV]
C281  10uF  VOLTAGE: 16V  [CC0603_OV]
C283  22uF  VOLTAGE: 10V  [CC0603_OV]
C285  22uF  VOLTAGE: 10V  [CC0603_OV]
C287  22uF  VOLTAGE: 10V  [CC0603_OV]
C295  10uF  VOLTAGE: 16V  [CC0603_OV]
C298  18pF  VOLTAGE: 50V  [0201_CC]
C299  18pF  VOLTAGE: 50V  [0201_CC]
C301  10uF  VOLTAGE: 16V  [CC0603_OV]
C303  22uF  VOLTAGE: 10V  [CC0603_OV]
C304  22uF  VOLTAGE: 10V  [CC0603_OV]
C306  10uF  VOLTAGE: 16V  [CC0603_OV]
C307  10uF  VOLTAGE: 16V  [CC0603_OV]
C311  22uF  VOLTAGE: 10V  [CC0603_OV]
C312  22uF  VOLTAGE: 10V  [CC0603_OV]
C316  10uF  VOLTAGE: 16V  [CC0603_OV]
C317  22uF  VOLTAGE: 10V  [CC0603_OV]
C323  4.7uF  VOLTAGE: 10V  [cc0402_tol0p15]
C324  22uF  VOLTAGE: 10V  [CC0603_OV]
C333  1uF  VOLTAGE: 6.3V  [0201_CC]
C337  1uF  VOLTAGE: 6.3V  [0201_CC]
C360  4.7uF  VOLTAGE: 10V  [cc0402_tol0p15]
C363  4.7uF  VOLTAGE: 10V  [cc0402_tol0p15]
C365  1.0UF  VOLTAGE: 16V  [CC0603_OV]
C406  1.0UF  VOLTAGE: 10V  [0402_CC]
C407  1.0UF  VOLTAGE: 10V  [0402_CC]
C408  1uF  VOLTAGE: 6.3V  [0201_CC]
C410  4.7uF  VOLTAGE: 10V  [cc0402_tol0p15]
J6  HDR 1X2 TH  [HDR_1X2]
L5  0.47uH  [ind_sph2520]
L6  0.47uH  [ind_sph2520]
L10  0.47uH  [ind_sph2520]
L11  1uH  [ind_sph2520]
L13  0.47uH  [IND_2016A]
L15  0.47uH  [ind_sph2520]
QZ2  32.768KHZ  [XTAL2-3P2X1P5-SM]
R48  0  [0402_CC]
R51  0  [0402_CC]
R52  0  [0402_CC]
R54  0  [0402_CC]
R55  0  [RC0402_25]
R57  1M  [0201_CC]
R106  100K  [0201_CC]
R111  0  [0402_CC]
R114  0  [0402_CC]
R127  0  [RC0402_25]
R140  0  [0402_CC]
R141  0  [0402_CC]
R142  0  [0402_CC]
R143  0  [0402_CC]
R144  0  [0402_CC]
R145  0  [0402_CC]
R146  0  [0402_CC]
U8  PCA9450AAHN  [hvqfn56_0p4_7x7_ep4p7mm]  (parts A,B,C of 3)
U10  LD39015M12R  [sot23-5]

### Nets
GND: C10.2 C11.2 C12.2 C13.2 C275.2 C279.1 C281.1 C283.2 C285.2 C287.2 C295.1 C298.2 C299.2 C301.1 C303.2 C304.2 C306.1 C307.1 C311.2 C312.2 C316.1 C317.2 C323.1 C324.2 C333.2 C337.2 C360.2 C363.2 C365.2 C406.2 C407.1 C408.2 C410.2 J6.2 U8.5(AGND) U8.43(BUCK_AGND) U8.57(EPAD) U10.2(GND) U10.4(NC)
NVCC_DRAM_1V1: C324.1 L15.2 U8.52(BUCK6FB)
NVCC_SD2: C365.1 U8.55(LDO5)
NVCC_SNVS_1V8: C333.1 U8.3(LDO1)
SWOUT_3V3: C410.1 U8.23(SWOUT)
VDD_1V8: C317.1 L13.2 R106.1 U8.14(BUCK5FB)
VDD_3V3: C311.1 C312.1 C323.2 C407.2 L11.2 R146.1 U8.21(BUCK4FB) U8.22(SWIN) U10.1(VIN) U10.3(ENABLE)
VDD_ARM_0V9: C283.1 C287.1 L6.2 R140.1 R141.2  [also labelled VDD_ARM_0V9_S]
VDD_DRAM&PU_0V9: C303.1 C304.1 L10.2 R144.1 R145.2  [also labelled VDD_DRAM&PU_0V9_S]
VDD_PHY_0V9: C360.1 U8.1(LDO4)
VDD_PHY_1V2: C408.1 U10.5(VOUT)
VDD_SNVS_0V8: C337.1 U8.2(LDO2)
VDD_SOC_0V8: C275.1 C285.1 L5.2 R142.1 R143.2  [also labelled VDD_SOC_0V8_S]
VDDA_1V8: C363.1 U8.54(LDO3)
VSYS_5V: C10.1 C11.1 C12.1 C13.1 C279.2 C281.2 C295.2 C301.2 C306.2 C307.2 C316.2 J6.1 U8.16(INB45_1) U8.17(INB45_2) U8.18(INB45_3) U8.33(INB13_1) U8.34(INB13_2) U8.35(INB13_3) U8.47(INB26_1) U8.48(INB26_2) U8.49(INB26_3) U8.53(VSYS) U8.56(INL1)
CLK_32K_OUT: U8.7(CLK_32K_OUT) ; off-sheet CLK_32K_OUT
I2C1_SCL: R48.1 ; off-sheet I2C1_SCL
I2C1_SDA: R54.1 ; off-sheet I2C1_SDA
LX1: L5.1 U8.36(LX1_1) U8.37(LX1_2)
LX2: L6.1 U8.45(LX2_1) U8.46(LX2_2)
LX3: L10.1 U8.31(LX3_1) U8.32(LX3_2)
LX4: L11.1 U8.19(LX4_1) U8.20(LX4_2)
LX5: L13.1 U8.15(LX5)
PMIC_nINT: U8.13(IRQ_B) ; off-sheet PMIC_nINT
PMIC_ON_REQ: R51.1 ; off-sheet PMIC_ON_REQ
PMIC_STBY_REQ: R52.1 ; off-sheet PMIC_STBY_REQ
POR_B: R114.2 ; off-sheet POR_B
R_SNSP1: R142.2 R143.1 U8.38(R_SNSP1)
R_SNSP2: R140.2 R141.1 U8.44(R_SNSP2)
R_SNSP3_CFG: R144.2 R145.1 U8.30(R_SNSP3_CFG)
RTC_RESET_B: R111.2 ; off-sheet RTC_RESET_B
SD2_VSEL: U8.29(SD_VSEL) ; off-sheet SD2_VSEL
SYS_nRST: R127.1 ; off-sheet SYS_nRST
VINT: C406.1 U8.4(VINT)
WDOG_B: R55.1 ; off-sheet WDOG_B
XIN_32K: C298.1 QZ2.2 R57.1 U8.10(XTAL_IN)
XOUT_32K: C299.1 QZ2.1 R57.2 U8.11(XTAL_OUT)
NetL15_1: L15.1 U8.50(LX6_1) U8.51(LX6_2)
NetR48_2: R48.2 U8.41(SCL)
NetR51_2: R51.2 U8.39(PMIC_ON_REQ)
NetR52_2: R52.2 U8.40(PMIC_STBY_REQ)
NetR54_2: R54.2 U8.42(SDA)
NetR55_2: R55.2 R106.2 U8.28(WDOG_B)
NetR111_1: R111.1 U8.6(RTC_RESET_B)
NetR114_1: R114.1 U8.9(POR_B)
NetR127_2: R127.2 U8.8(PMIC_RST_B)
NetR146_2: R146.2 U8.12(SW_EN)

Not connected (* = marked no-connect by the designer): U8 24(SDAH)* 25(SCLH)* 26(SDAL)* 27(SCLL)*

### Layout directives
rule Supply Nets [Voltage = 5.000]; net class POWER: VSYS_5V
rule Supply Nets [Voltage = 3.300]; net class POWER: SWOUT_3V3

### Notes on the sheet
- SYS PMIC
- 1.8V 10mA
- 0.85/0.95/1.0V 3A
- 0.85V 10mA
- Sense from Processor power pin
- 1.8V 300mA
- 0.85V 3A
- 0.9V 250mA
- 0.85/0.9/0.95 3A
- 3.3V/1.8V 150mA
- Use 1uF on NVCC_SD2 for short transition time of 3.3V/1.8V switching.
- (near C365) Note:
- 3.3V 3A
- Extra LDO for 1V2
- (near C317) 1.8V 1.5A
- 1.2V 150mA
- (near C324) 1.1V 3A
- Backup PWR Supply
- SWIN: 2.8V-5.5V
- Note:
- BUCK2 default output voltage is 0.85V for A53 1.2GHz. Software will change it to 0.95V for A53 1.6GHz, 1.0V for A53 1.8GHz.
- BUCK3 default output voltage is 0.85V for DDRC 1GHz. Software will change it to 0.9V for DDRC 1.2GHz, 0.95V for DDRC 1.5GHz in SPL before DDR initialization.
- i.MX8M Mini Power Sequence
- SEQ
- PWR/Signal
- REG
- MIN
- TYP
- MAX
- Max Current(mA)
- # System Reset Button
- IPU
- (near U8) Internal LDO
- # CPU WDOG_B Reset
- PU
- OD
- (near U8) OD
- 1
  2
  3
  4
  5
  6
  7
  8
  9
  10
  11
  12
  13
  14
  15
- NVCC_SNVS_1V8
  VDD_SNVS_0V8
  RTC_RESET_B
  CLK_32K_OUT
  VDD_SOC_0V8
  VDD_DRAM&PU_0V9
  VDD_PHY_0V9
  VDD_ARM_0V9
  VDDA_1V8
  VDD_1V8/NVCC_1V8/NVCC_ENET
  NVCC_DRAM_1V1
  NVCC_3V3
  VDD_PHY_1V2
  NVCC_SD2
  POR_B
- LDO1
  LDO2
  RTC_RESET_B
  RTC_CLK
  BUCK1
  BUCK3
  LDO4
  BUCK2
  LDO3
  BUCK5
  BUCK6
  BUCK4
  LDO(Discrete)
  LDO5
  POR_B
- 1.62
  0.76
  --
  --
  0.78/0.805
  0.805/0.855
  0.855
  0.805/0.9/0.95
  1.71
  1.65
  1.06
  3
  1.14
  3.0/1.65
  --
- 1.8
  0.8
  --
  --
  0.82/0.85
  0.85/0.9/0.95
  0.9
  0.85/0.95/1.0
  1.8
  1.8
  1.1
  3.3
  1.2
  3.3/1.8
  --
- 1.98
  0.9
  --
  --
  0.9
  0.9/1.0
  1.0
  0.95/1.0/1.05
  1.89
  1.95
  1.14
  3.6
  1.26
  3.6/1.95
  --
- 10
  10
  --
  --
  3000
  3000
  200
  3000
  300
  2000
  2000
  3000
  150
  150
  --
- 1.8
  0.8
  --
  --
  0.82/0.85
  0.85/0.9/0.95
  0.9
  0.85/0.95/1.0
  1.8
  1.8
  1.1
  3.3
  1.8
  1.2
  3.3/1.8
  --
- 1. PWRON is used as RESET Button as default, need to configure  PWRON long push as 10ms/Cold Reset, and disable short push detect!
- 2. WDOG_B is used as Cold Reset, external pull up is needed. For normal usage, WDOG_B/GPIO1_IO02 has internal pull up, don't need the external PU resistor,
  but in Boundary Scan mode, this pin is floating, external PU is necessary.
- DWG. NO.
- REV.
- SHT.
- REVISION
- DESCRIPTION
- DATE
- APPROVED
- ENG:
- DSN:
- APPROVALS
- PROJECT
- REFERENCE DOCUMENTS
- BOM:
- CHK:
- TITLE
- ASSY DWG:
- FAB DWG:
- PCB DWG:
- SIZE
- FILE NAME
- C
- SCHEMATIC DOCUMENT NUMBER
- SHEET
- OF
- REV

### Library data of the parts
C10 = CAP_NP: CAP CER 1.0UF 10V 10% X5R 0402; MFG_NAME01: YAGEO AMERICA; MFG_PN01: CC0402KRX5R6BB105; EIA Case: 0402; Value: 1.0UF; ROHS: Yes; PCB Footprint: 0402_CC
C11 = CAP_NP: CAP CER 2.2uF 16V 10% X5R 0402; MFG_NAME01: MURATA; MFG_PN01: GRM155R61C225KE44; EIA Case: 0402; Temp Range: -55°C ~ 85°C; Value: 2.2uF; PCB Footprint: 0402_CC; Tolerance: 10%; ROHS: Yes
C12 C13 = CAP_NP: CAP CER 2.2uF 16V 10% X5R 0402; MFG_PN01: GRM155R61C225KE44; MFG_NAME01: MURATA; EIA Case: 0402; Temp Range: -55°C ~ 85°C; Value: 2.2uF; PCB Footprint: 0402_CC; ROHS: Yes; Tolerance: 10%
C275 C285 C303 C312 C317 C324 = CAP_NP: CAP CER 22uF 10V 20% X5R 0603; MFG_PN01: C1608X5R1A226M080AC; MFG_NAME01: TDK; EIA Case: 0603; Value: 22uF; ROHS: Yes; Tolerance: 20%; PCB Footprint: CC0603_OV
C279 C301 C307 = CAP_NP: CAP CER 10.0uF 16V 10% X5R 0603; MFG_PN01: GRM188R61C106KAALD; MFG_NAME01: MURATA; EIA Case: 0603; Temp Range: -55°C ~ 85°C; Value: 10uF; ROHS: Yes; Tolerance: 10%; PCB Footprint: CC0603_OV
C281 C295 C306 C316 = CAP_NP: CAP CER 10.0uF 16V 10% X5R 0603; MFG_NAME01: MURATA; MFG_PN01: GRM188R61C106KAALD; EIA Case: 0603; Temp Range: -55°C ~ 85°C; Value: 10uF; Tolerance: 10%; ROHS: Yes; PCB Footprint: CC0603_OV
C283 C304 = CAP_NP: CAP CER 22uF 10V 20% X5R 0603; EIA Case: 0603; MFG_NAME01: TDK; MFG_PN01: C1608X5R1A226M080AC; Value: 22uF; Tolerance: 20%; ROHS: Yes; PCB Footprint: CC0603_OV
C287 C311 = CAP_NP: CAP CER 22uF 10V 20% X5R 0603; MFG_NAME01: TDK; MFG_PN01: C1608X5R1A226M080AC; EIA Case: 0603; Value: 22uF; Tolerance: 20%; ROHS: Yes; PCB Footprint: CC0603_OV
C298 = CAP_NP: CAP CER 18pF 50V 5% C0G 0201; EIA Case: 0201; MFG_NAME01: MURATA; MFG_PN01: GRM0335C1H180JA01D; Value: 18pF; Tolerance: 5%; ROHS: Yes; PCB Footprint: 0201_CC
C299 = CAP_NP: CAP CER 18pF 50V 5% C0G 0201; EIA Case: 0201; MFG_PN01: GRM0335C1H180JA01D; MFG_NAME01: MURATA; Value: 18pF; ROHS: Yes; Tolerance: 5%; PCB Footprint: 0201_CC
C323 C363 C410 = CAP_NP: CAP CER 4.7uF 10V 10% X5R 0402; MFG_PN01: CL05A475KP5NRNC; MFG_NAME01: SAMSUNG ELECTRO MECHANICS; EIA Case: 0402; Value: 4.7uF; ROHS: Yes; Tolerance: 10%; PCB Footprint: cc0402_tol0p15
C333 C337 C408 = CAP_NP: CAP CER 1uF 6.3V 20% X5R 0201; MFG_NAME01: AVX; MFG_PN01: 02016D105MAT2A; EIA Case: 0201; Value: 1uF; PCB Footprint: 0201_CC; Tolerance: 20%; ROHS: Yes
C360 = CAP_NP: CAP CER 4.7uF 10V 10% X5R 0402; MFG_NAME01: SAMSUNG ELECTRO MECHANICS; MFG_PN01: CL05A475KP5NRNC; EIA Case: 0402; Value: 4.7uF; Tolerance: 10%; ROHS: Yes; PCB Footprint: cc0402_tol0p15
C365 = CAP_NP: CAP CER 1.0UF 16V 10% X5R 0603; MFG_PN01: C1608X5R1C105K; MFG_NAME01: TDK; EIA Case: 0603; Value: 1.0UF; PCB Footprint: CC0603_OV; ROHS: Yes; Tolerance: 10%
C406 C407 = CAP_NP: CAP CER 1.0UF 10V 10% X5R 0402; EIA Case: 0402; MFG_NAME01: YAGEO AMERICA; MFG_PN01: CC0402KRX5R6BB105; Value: 1.0UF; ROHS: Yes; PCB Footprint: 0402_CC
J6 = CONN_HDR_2X1: HDR 1X2 TH 100MIL SP 339H AU 98L; MFG_PN01: TSW-102-07-G-S; MFG_NAME01: SAMTEC; Temp Range: -55°C ~ 155°C; Value: HDR 1X2 TH; ROHS: Yes; PCB Footprint: HDR_1X2
L5 L15 = INDUCTOR: IND PWR 0.47uH@1MHZ 4.7A 20% SMT; Temp Range: -40°C ~ 125°C; EIA Case: 2520 (Metric); MFG_NAME01: SHENZHEN SUNLORD ELECTRONICS CO., LTD; MFG_PN01: WPN252012ER47MT; Value: 0.47uH; PCB Footprint: ind_sph2520; ROHS: Yes; Tolerance: 20%
L6 = INDUCTOR: IND PWR 0.47uH@1MHZ 4.7A 20% SMT; Temp Range: -40°C ~ 125°C; EIA Case: 2520 (Metric); MFG_PN01: WPN252012ER47MT; MFG_NAME01: SHENZHEN SUNLORD ELECTRONICS CO., LTD; Value: 0.47uH; ROHS: Yes; Tolerance: 20%; PCB Footprint: ind_sph2520
L10 = INDUCTOR: IND PWR 0.47uH@1MHZ 4.7A 20% SMT; Temp Range: -40°C ~ 125°C; MFG_PN01: WPN252012ER47MT; MFG_NAME01: SHENZHEN SUNLORD ELECTRONICS CO., LTD; EIA Case: 2520 (Metric); Value: 0.47uH; PCB Footprint: ind_sph2520; ROHS: Yes; Tolerance: 20%
L11 = INDUCTOR: IND PWR 1uH@1MHZ 4.2A 20% SMT; Temp Range: -40°C ~125°C; EIA Case: 2520 (Metric); MFG_NAME01: SHENZHEN SUNLORD ELECTRONICS CO., LTD; MFG_PN01: WPN252012H1R0MT; Value: 1uH; PCB Footprint: ind_sph2520; ROHS: Yes
L13 = INDUCTOR: IND WW 0.47uH@1MHz 3.4A 20% 2016; Temp Range: -40°C ~ 85°C; VOLTAGE: 20V DC; EIA Case: 2016 (Metric); MFG_PN01: 1286AS-H-R47M=P2; MFG_NAME01: MURATA; Value: 0.47uH; PCB Footprint: IND_2016A; ROHS: Yes; Tolerance: 20%
QZ2 = XTAL: XTAL 32.768KHZ 12.5PF 20PPM 3.2X1.5MM SMT; MFG_NAME01: Abracon Corporation; MFG_PN01: ABS07-32.768KHZ-T; EIA Case: 3215 (Metric); Value: 32.768KHZ; ROHS: Yes; PCB Footprint: XTAL2-3P2X1P5-SM
R48 R52 R54 R114 = RES: RES MF ZERO OHM 1/16W 5% 0402; Temp Range: -55°C ~ 125°C; EIA Case: 0402; MFG_PN01: MCR01MZPJ000; MFG_NAME01: ROHM; Value: 0; ROHS: Yes; Tolerance: 5%; PCB Footprint: 0402_CC; Rated Power: 1/16W
R51 = RES: RES MF ZERO OHM 1/16W 5% 0402; Temp Range: -55°C ~ 125°C; EIA Case: 0402; MFG_NAME01: ROHM; MFG_PN01: MCR01MZPJ000; Value: 0; Tolerance: 5%; ROHS: Yes; PCB Footprint: 0402_CC; Rated Power: 1/16W
R55 = RES: RES MF ZERO OHM 1/16W 5% 0402; EIA Case: 0402; MFG_PN01: MCR01MZPJ000; MFG_NAME01: ROHM; Value: 0; ROHS: Yes; Tolerance: 5%; PCB Footprint: RC0402_25; Rated Power: 1/16W
R57 = RES: RES MF 1.0M 1/20W 5% AEC-Q200 0201; Temp Range: -55°C ~ 125°C; VOLTAGE: 25V; EIA Case: 0201; MFG_NAME01: PANASONIC; MFG_PN01: ERJ-1GNJ105C; Value: 1M; Tolerance: 5%; ROHS: Yes; PCB Footprint: 0201_CC; Rated Power: 1/20W
R106 = RES: RES MF 100K 1/20W 1% 0201; MFG_PN01: RC-0201-104FT; MFG_NAME01: SKYMOS; EIA Case: 0201; Value: 100K; ROHS: Yes; Tolerance: 1%; PCB Footprint: 0201_CC; Rated Power: 1/20W
R111 R140 R144 R146 = RES: RES MF ZERO OHM 1/16W 5% 0402; MFG_PN01: MCR01MZPJ000; MFG_NAME01: ROHM; EIA Case: 0402; Temp Range: -55°C ~ 125°C; Value: 0; ROHS: Yes; Tolerance: 5%; PCB Footprint: 0402_CC; Rated Power: 1/16W
R127 = RES: RES MF ZERO OHM 1/16W 5% 0402; EIA Case: 0402; MFG_NAME01: ROHM; MFG_PN01: MCR01MZPJ000; Value: 0; Tolerance: 5%; ROHS: Yes; PCB Footprint: RC0402_25; Rated Power: 1/16W
R141-R143 R145 = RES: RES MF ZERO OHM 1/16W 5% 0402; MFG_NAME01: ROHM; MFG_PN01: MCR01MZPJ000; EIA Case: 0402; Temp Range: -55°C ~ 125°C; Value: 0; Tolerance: 5%; ROHS: Yes; PCB Footprint: 0402_CC; Rated Power: 1/16W
U8 = PCA9450_HVQFN56P_A: IC POWER MANAGEMENT 2.7-5.5V HVQFN56; MFG_NAME01: NXP SEMICONDUCTORS; Temp Range: -40°C ~ 105°C; JEDEC Case: QFN56; Value: PCA9450AAHN; MFG_PN01: PCA9450AAHN; ROHS: Yes; VOLTAGE: 2.7-5.5V; PCB Footprint: hvqfn56_0p4_7x7_ep4p7mm
U10 = NCV571_5P: IC LIN VREG LDO 1.2V 150mA 1.5-5.5V SOT23-5; MFG_NAME01: ST MICROELECTRONICS; Temp Range: -40°C ~ 125°C; EIA Case: SOT-23; Value: LD39015M12R; PCB Footprint: sot23-5; MFG_PN01: LD39015M12R; ROHS: Yes

## Sheet 10-BBCON QCMI SOM.SchDoc: SOM Interface
size 431 x 279 mm; CAGE_CODE: 8LSW1; Designer: B. Jordan; DsnPath: G:\My Drive\Quilter Computer - Engineering Assets\NXP i.MX8M-Mini\8MMINILPD4-CPU2-DESIGNFILES\8MMINILPD4-CPU2-DESIGNFILES\SCH-47712_A4.DSN; ApprovedBy: S. Nesterenko; CheckedBy: D. Gudino; Author: B. Jordan; CompanyName: Allegro Labs, Inc.; DrawnBy: B. Jordan; Engineer: B. Jordan; Organization: QLTR; Address1: 29315 Stonecrest Rd; Address2: Rolling Hills Estates; Address3: CA, 90275; Address4: USA; DocumentNumber: QCMISM-SCH-10-0; Revision: 0; SheetNumber: 10; SheetTotal: 10; ENG_APP_DATE: --/--/--; DSN_APP_DATE: --/--/--; CHK_APP_DATE: --/--/--; DOC_NO_BOM: TBD; DOC_NO_ASSY_DWG: TBD; DOC_NO_FAB_DWG: TBD; DOC_NO_PCB_DWG: TBD
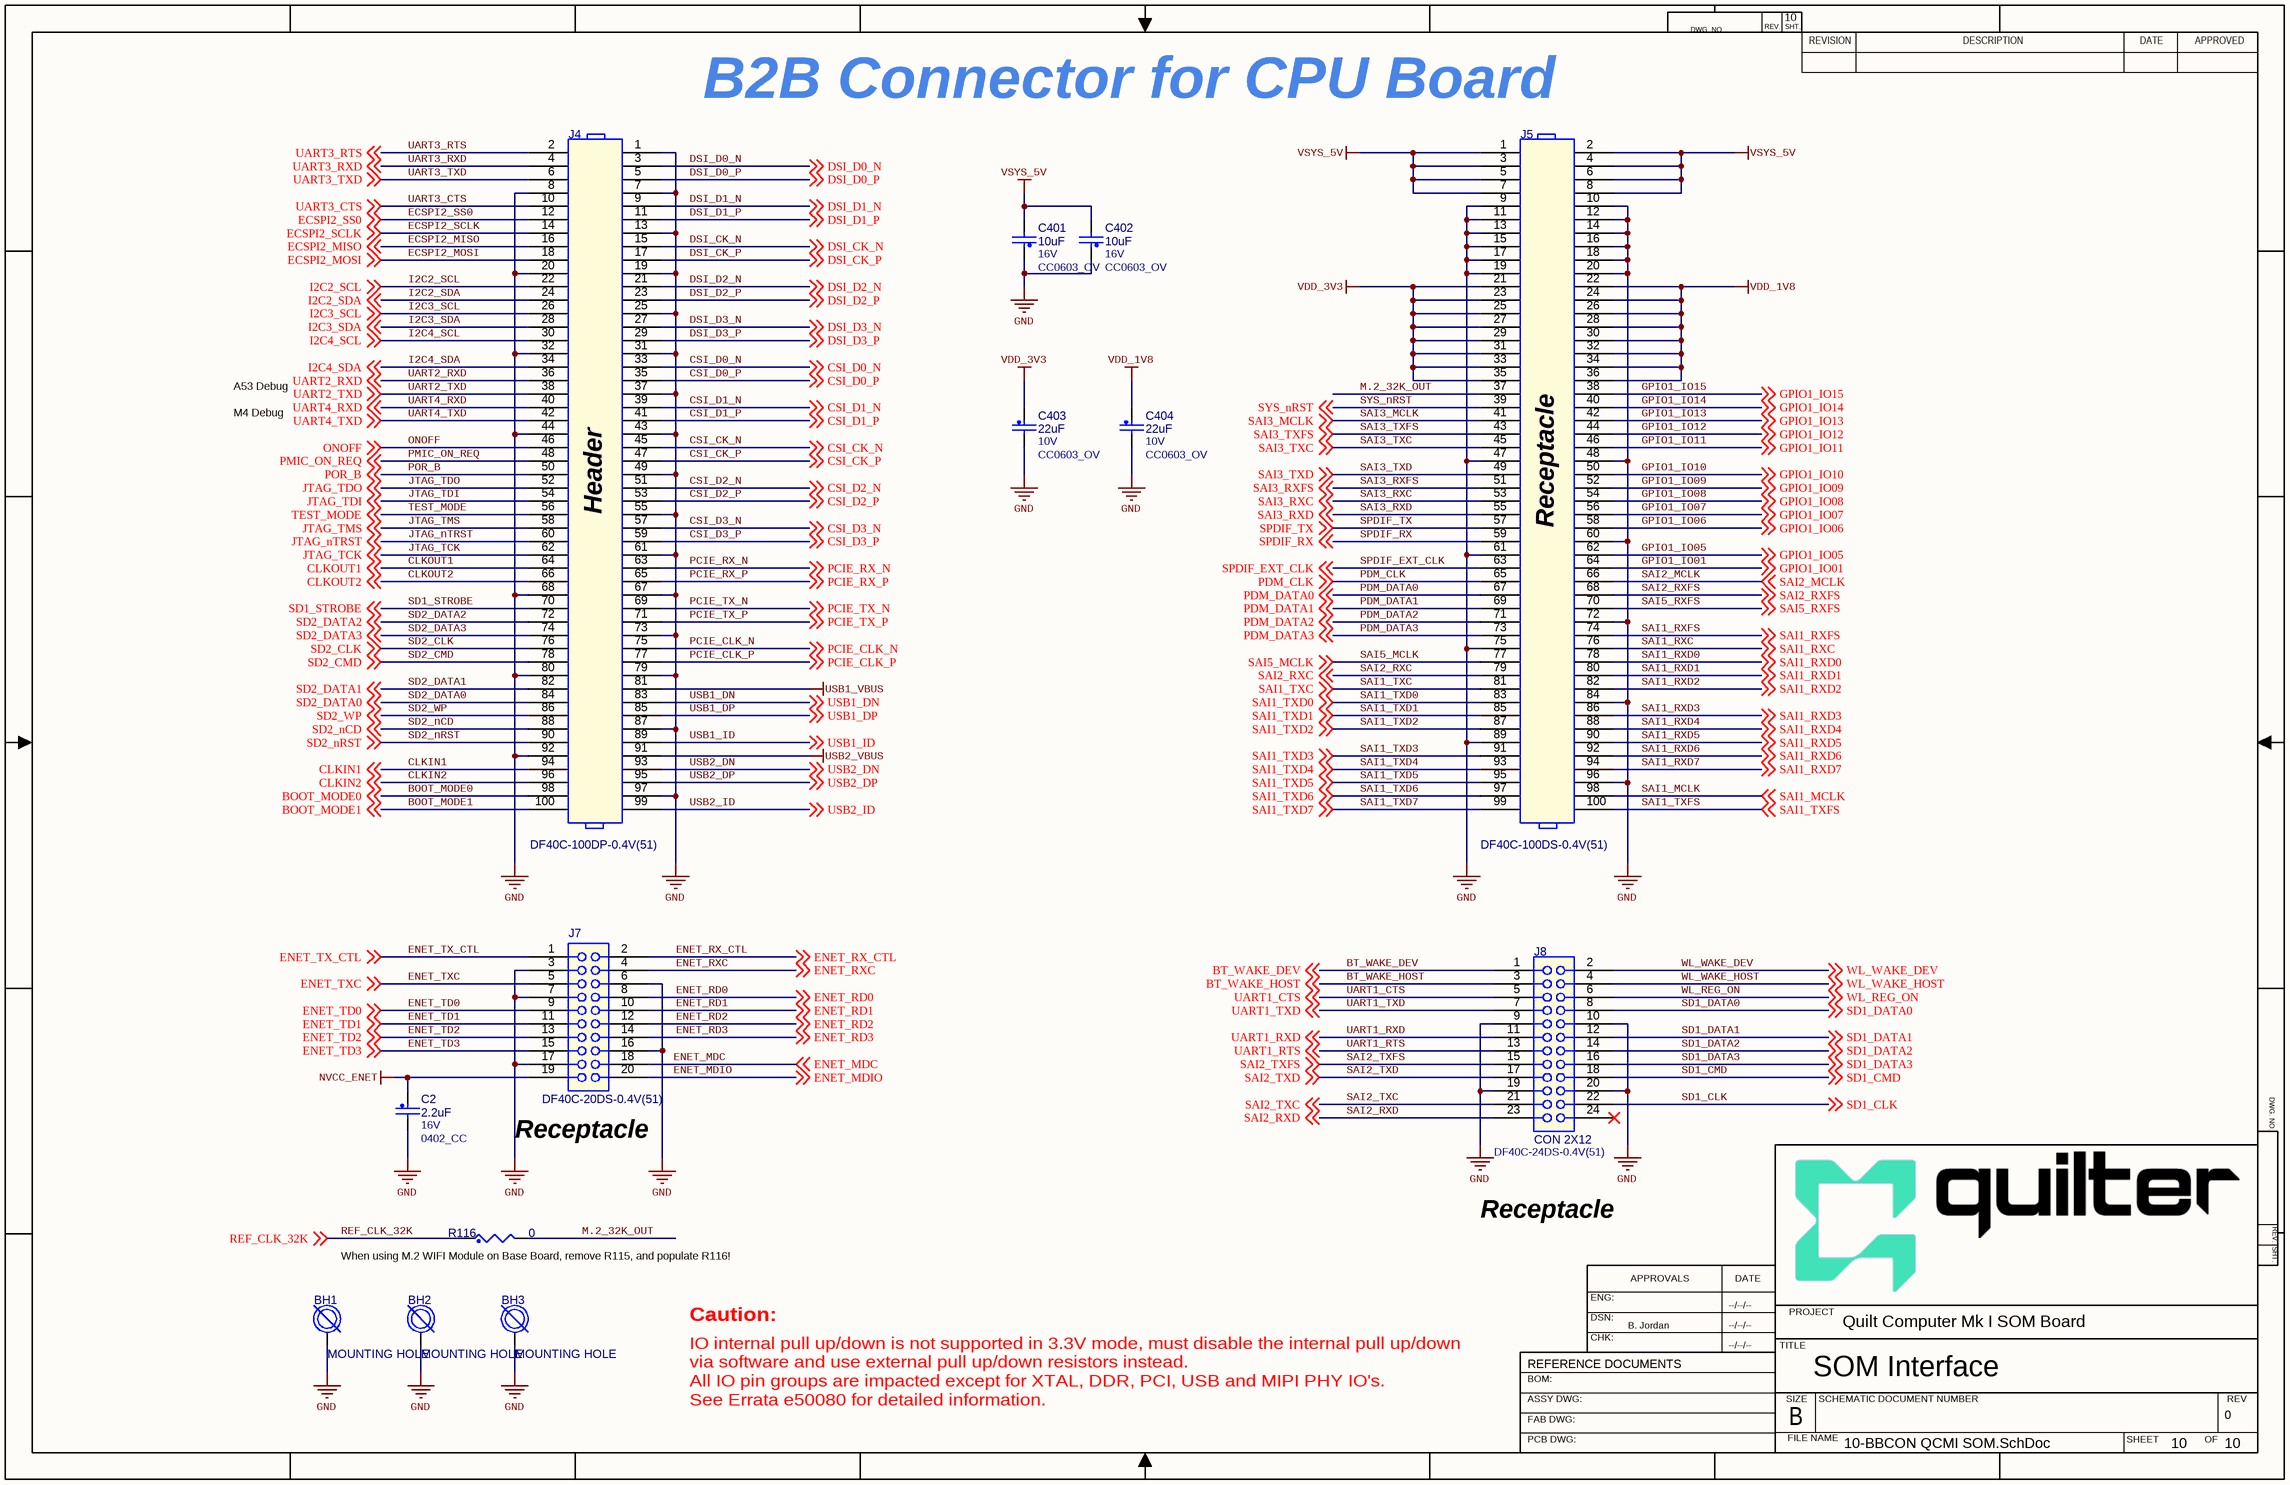
[diagram p11: 10-BBCON QCMI SOM.SchDoc]

### Parts
BH1  MOUNTING HOLE  [GNDPOINT256]
BH2  MOUNTING HOLE  [GNDPOINT256]
BH3  MOUNTING HOLE  [GNDPOINT256]
C2  2.2uF  VOLTAGE: 16V  [0402_CC]
C401  10uF  VOLTAGE: 16V  [CC0603_OV]
C402  10uF  VOLTAGE: 16V  [CC0603_OV]
C403  22uF  VOLTAGE: 10V  [CC0603_OV]
C404  22uF  VOLTAGE: 10V  [CC0603_OV]
J4  DF40C-100DP-0.4V(51)  [con100_0p4_21p7x2p05_sm]
J5  DF40C-100DS-0.4V(51)  [con100_0p4_22p8x3p1_sm]
J7  DF40C-20DS-0.4V(51)  [con20_0p4_6p8x3p1_sm]
J8  CON 2X12  MFG_PN01: DF40C-24DS-0.4V(51)  [con24_0p4_7p6x3p08_sm]
R116  0  [RC0402_25]

### Nets
GND: BH1.1 BH2.1 BH3.1 C2.2 C401.1 C402.1 C403.2 C404.2 J4.1 J4.7 J4.8 J4.13 J4.19 J4.20 J4.25 J4.31 J4.32 J4.37 J4.43 J4.44 J4.49 J4.55 J4.61 J4.67 J4.68 J4.73 J4.79 J4.80 J4.87 J4.92 J4.97 J5.9 J5.10 J5.11 J5.12 J5.13 J5.14 J5.15 J5.16 J5.17 J5.18 J5.19 J5.20 J5.47 J5.48 J5.60 J5.61 J5.72 J5.75 J5.84 J5.89 J5.96 J7.3 J7.6 J7.7 J7.16 J7.17 J8.9(A5) J8.10(B5) J8.19(A10) J8.20(B10)
NVCC_ENET: C2.1 J7.19
USB1_VBUS: J4.81
USB2_VBUS: J4.91
VDD_1V8: C404.1 J5.22 J5.24 J5.26 J5.28 J5.30 J5.32 J5.34 J5.36
VDD_3V3: C403.1 J5.21 J5.23 J5.25 J5.27 J5.29 J5.31 J5.33 J5.35
VSYS_5V: C401.2 C402.2 J5.1 J5.2 J5.3 J5.4 J5.5 J5.6 J5.7 J5.8
BOOT_MODE0: J4.98 ; off-sheet BOOT_MODE0
BOOT_MODE1: J4.100 ; off-sheet BOOT_MODE1
BT_WAKE_DEV: J8.1(A1) ; off-sheet BT_WAKE_DEV
BT_WAKE_HOST: J8.3(A2) ; off-sheet BT_WAKE_HOST
CLKIN1: J4.94 ; off-sheet CLKIN1
CLKIN2: J4.96 ; off-sheet CLKIN2
CLKOUT1: J4.64 ; off-sheet CLKOUT1
CLKOUT2: J4.66 ; off-sheet CLKOUT2
CSI_CK_N: J4.45 ; off-sheet CSI_CK_N
CSI_CK_P: J4.47 ; off-sheet CSI_CK_P
CSI_D0_N: J4.33 ; off-sheet CSI_D0_N
CSI_D0_P: J4.35 ; off-sheet CSI_D0_P
CSI_D1_N: J4.39 ; off-sheet CSI_D1_N
CSI_D1_P: J4.41 ; off-sheet CSI_D1_P
CSI_D2_N: J4.51 ; off-sheet CSI_D2_N
CSI_D2_P: J4.53 ; off-sheet CSI_D2_P
CSI_D3_N: J4.57 ; off-sheet CSI_D3_N
CSI_D3_P: J4.59 ; off-sheet CSI_D3_P
DSI_CK_N: J4.15 ; off-sheet DSI_CK_N
DSI_CK_P: J4.17 ; off-sheet DSI_CK_P
DSI_D0_N: J4.3 ; off-sheet DSI_D0_N
DSI_D0_P: J4.5 ; off-sheet DSI_D0_P
DSI_D1_N: J4.9 ; off-sheet DSI_D1_N
DSI_D1_P: J4.11 ; off-sheet DSI_D1_P
DSI_D2_N: J4.21 ; off-sheet DSI_D2_N
DSI_D2_P: J4.23 ; off-sheet DSI_D2_P
DSI_D3_N: J4.27 ; off-sheet DSI_D3_N
DSI_D3_P: J4.29 ; off-sheet DSI_D3_P
ECSPI2_MISO: J4.16 ; off-sheet ECSPI2_MISO
ECSPI2_MOSI: J4.18 ; off-sheet ECSPI2_MOSI
ECSPI2_SCLK: J4.14 ; off-sheet ECSPI2_SCLK
ECSPI2_SS0: J4.12 ; off-sheet ECSPI2_SS0
ENET_MDC: J7.18 ; off-sheet ENET_MDC
ENET_MDIO: J7.20 ; off-sheet ENET_MDIO
ENET_RD0: J7.8 ; off-sheet ENET_RD0
ENET_RD1: J7.10 ; off-sheet ENET_RD1
ENET_RD2: J7.12 ; off-sheet ENET_RD2
ENET_RD3: J7.14 ; off-sheet ENET_RD3
ENET_RX_CTL: J7.2 ; off-sheet ENET_RX_CTL
ENET_RXC: J7.4 ; off-sheet ENET_RXC
ENET_TD0: J7.9 ; off-sheet ENET_TD0
ENET_TD1: J7.11 ; off-sheet ENET_TD1
ENET_TD2: J7.13 ; off-sheet ENET_TD2
ENET_TD3: J7.15 ; off-sheet ENET_TD3
ENET_TX_CTL: J7.1 ; off-sheet ENET_TX_CTL
ENET_TXC: J7.5 ; off-sheet ENET_TXC
GPIO1_IO01: J5.64 ; off-sheet GPIO1_IO01
GPIO1_IO05: J5.62 ; off-sheet GPIO1_IO05
GPIO1_IO06: J5.58 ; off-sheet GPIO1_IO06
GPIO1_IO07: J5.56 ; off-sheet GPIO1_IO07
GPIO1_IO08: J5.54 ; off-sheet GPIO1_IO08
GPIO1_IO09: J5.52 ; off-sheet GPIO1_IO09
GPIO1_IO10: J5.50 ; off-sheet GPIO1_IO10
GPIO1_IO11: J5.46 ; off-sheet GPIO1_IO11
GPIO1_IO12: J5.44 ; off-sheet GPIO1_IO12
GPIO1_IO13: J5.42 ; off-sheet GPIO1_IO13
GPIO1_IO14: J5.40 ; off-sheet GPIO1_IO14
GPIO1_IO15: J5.38 ; off-sheet GPIO1_IO15
I2C2_SCL: J4.22 ; off-sheet I2C2_SCL
I2C2_SDA: J4.24 ; off-sheet I2C2_SDA
I2C3_SCL: J4.26 ; off-sheet I2C3_SCL
I2C3_SDA: J4.28 ; off-sheet I2C3_SDA
I2C4_SCL: J4.30 ; off-sheet I2C4_SCL
I2C4_SDA: J4.34 ; off-sheet I2C4_SDA
JTAG_nTRST: J4.60 ; off-sheet JTAG_nTRST
JTAG_TCK: J4.62 ; off-sheet JTAG_TCK
JTAG_TDI: J4.54 ; off-sheet JTAG_TDI
JTAG_TDO: J4.52 ; off-sheet JTAG_TDO
JTAG_TMS: J4.58 ; off-sheet JTAG_TMS
M.2_32K_OUT: J5.37 R116.2
ONOFF: J4.46 ; off-sheet ONOFF
PCIE_CLK_N: J4.75 ; off-sheet PCIE_CLK_N
PCIE_CLK_P: J4.77 ; off-sheet PCIE_CLK_P
PCIE_RX_N: J4.63 ; off-sheet PCIE_RX_N
PCIE_RX_P: J4.65 ; off-sheet PCIE_RX_P
PCIE_TX_N: J4.69 ; off-sheet PCIE_TX_N
PCIE_TX_P: J4.71 ; off-sheet PCIE_TX_P
PDM_CLK: J5.65 ; off-sheet PDM_CLK
PDM_DATA0: J5.67 ; off-sheet PDM_DATA0
PDM_DATA1: J5.69 ; off-sheet PDM_DATA1
PDM_DATA2: J5.71 ; off-sheet PDM_DATA2
PDM_DATA3: J5.73 ; off-sheet PDM_DATA3
PMIC_ON_REQ: J4.48 ; off-sheet PMIC_ON_REQ
POR_B: J4.50 ; off-sheet POR_B
REF_CLK_32K: R116.1 ; off-sheet REF_CLK_32K
SAI1_MCLK: J5.98 ; off-sheet SAI1_MCLK
SAI1_RXC: J5.76 ; off-sheet SAI1_RXC
SAI1_RXD0: J5.78 ; off-sheet SAI1_RXD0
SAI1_RXD1: J5.80 ; off-sheet SAI1_RXD1
SAI1_RXD2: J5.82 ; off-sheet SAI1_RXD2
SAI1_RXD3: J5.86 ; off-sheet SAI1_RXD3
SAI1_RXD4: J5.88 ; off-sheet SAI1_RXD4
SAI1_RXD5: J5.90 ; off-sheet SAI1_RXD5
SAI1_RXD6: J5.92 ; off-sheet SAI1_RXD6
SAI1_RXD7: J5.94 ; off-sheet SAI1_RXD7
SAI1_RXFS: J5.74 ; off-sheet SAI1_RXFS
SAI1_TXC: J5.81 ; off-sheet SAI1_TXC
SAI1_TXD0: J5.83 ; off-sheet SAI1_TXD0
SAI1_TXD1: J5.85 ; off-sheet SAI1_TXD1
SAI1_TXD2: J5.87 ; off-sheet SAI1_TXD2
SAI1_TXD3: J5.91 ; off-sheet SAI1_TXD3
SAI1_TXD4: J5.93 ; off-sheet SAI1_TXD4
SAI1_TXD5: J5.95 ; off-sheet SAI1_TXD5
SAI1_TXD6: J5.97 ; off-sheet SAI1_TXD6
SAI1_TXD7: J5.99 ; off-sheet SAI1_TXD7
SAI1_TXFS: J5.100 ; off-sheet SAI1_TXFS
SAI2_MCLK: J5.66 ; off-sheet SAI2_MCLK
SAI2_RXC: J5.79 ; off-sheet SAI2_RXC
SAI2_RXD: J8.23(A12) ; off-sheet SAI2_RXD
SAI2_RXFS: J5.68 ; off-sheet SAI2_RXFS
SAI2_TXC: J8.21(A11) ; off-sheet SAI2_TXC
SAI2_TXD: J8.17(A9) ; off-sheet SAI2_TXD
SAI2_TXFS: J8.15(A8) ; off-sheet SAI2_TXFS
SAI3_MCLK: J5.41 ; off-sheet SAI3_MCLK
SAI3_RXC: J5.53 ; off-sheet SAI3_RXC
SAI3_RXD: J5.55 ; off-sheet SAI3_RXD
SAI3_RXFS: J5.51 ; off-sheet SAI3_RXFS
SAI3_TXC: J5.45 ; off-sheet SAI3_TXC
SAI3_TXD: J5.49 ; off-sheet SAI3_TXD
SAI3_TXFS: J5.43 ; off-sheet SAI3_TXFS
SAI5_MCLK: J5.77 ; off-sheet SAI5_MCLK
SAI5_RXFS: J5.70 ; off-sheet SAI5_RXFS
SD1_CLK: J8.22(B11) ; off-sheet SD1_CLK
SD1_CMD: J8.18(B9) ; off-sheet SD1_CMD
SD1_DATA0: J8.8(B4) ; off-sheet SD1_DATA0
SD1_DATA1: J8.12(B6) ; off-sheet SD1_DATA1
SD1_DATA2: J8.14(B7) ; off-sheet SD1_DATA2
SD1_DATA3: J8.16(B8) ; off-sheet SD1_DATA3
SD1_STROBE: J4.70 ; off-sheet SD1_STROBE
SD2_CLK: J4.76 ; off-sheet SD2_CLK
SD2_CMD: J4.78 ; off-sheet SD2_CMD
SD2_DATA0: J4.84 ; off-sheet SD2_DATA0
SD2_DATA1: J4.82 ; off-sheet SD2_DATA1
SD2_DATA2: J4.72 ; off-sheet SD2_DATA2
SD2_DATA3: J4.74 ; off-sheet SD2_DATA3
SD2_nCD: J4.88 ; off-sheet SD2_nCD
SD2_nRST: J4.90 ; off-sheet SD2_nRST
SD2_WP: J4.86 ; off-sheet SD2_WP
SPDIF_EXT_CLK: J5.63 ; off-sheet SPDIF_EXT_CLK
SPDIF_RX: J5.59 ; off-sheet SPDIF_RX
SPDIF_TX: J5.57 ; off-sheet SPDIF_TX
SYS_nRST: J5.39 ; off-sheet SYS_nRST
TEST_MODE: J4.56 ; off-sheet TEST_MODE
UART1_CTS: J8.5(A3) ; off-sheet UART1_CTS
UART1_RTS: J8.13(A7) ; off-sheet UART1_RTS
UART1_RXD: J8.11(A6) ; off-sheet UART1_RXD
UART1_TXD: J8.7(A4) ; off-sheet UART1_TXD
UART2_RXD: J4.36 ; off-sheet UART2_RXD
UART2_TXD: J4.38 ; off-sheet UART2_TXD
UART3_CTS: J4.10 ; off-sheet UART3_CTS
UART3_RTS: J4.2 ; off-sheet UART3_RTS
UART3_RXD: J4.4 ; off-sheet UART3_RXD
UART3_TXD: J4.6 ; off-sheet UART3_TXD
UART4_RXD: J4.40 ; off-sheet UART4_RXD
UART4_TXD: J4.42 ; off-sheet UART4_TXD
USB1_DN: J4.83 ; off-sheet USB1_DN
USB1_DP: J4.85 ; off-sheet USB1_DP
USB1_ID: J4.89 ; off-sheet USB1_ID
USB2_DN: J4.93 ; off-sheet USB2_DN
USB2_DP: J4.95 ; off-sheet USB2_DP
USB2_ID: J4.99 ; off-sheet USB2_ID
WL_REG_ON: J8.6(B3) ; off-sheet WL_REG_ON
WL_WAKE_DEV: J8.2(B1) ; off-sheet WL_WAKE_DEV
WL_WAKE_HOST: J8.4(B2) ; off-sheet WL_WAKE_HOST

Not connected (* = marked no-connect by the designer): J8 24(B12)*

### Notes on the sheet
- (near J5) B2B Connector for CPU Board
- A53 Debug
- M4 Debug
- (near J4) Header
- (near J5) Receptacle
- (near J7) Receptacle
- Receptacle
- (near R116) When using M.2 WIFI Module on Base Board, remove R115, and populate R116!
- Caution:
- IO internal pull up/down is not supported in 3.3V mode, must disable the internal pull up/down
  via software and use external pull up/down resistors instead.
  All IO pin groups are impacted except for XTAL, DDR, PCI, USB and MIPI PHY IO's.
  See Errata e50080 for detailed information.
- DWG. NO.
- REV.
- SHT.
- REVISION
- DESCRIPTION
- DATE
- APPROVED
- ENG:
- APPROVALS
- REFERENCE DOCUMENTS
- DSN:
- CHK:
- TITLE
- PROJECT
- BOM:
- ASSY DWG:
- FAB DWG:
- SIZE
- FILE NAME
- B
- SCHEMATIC DOCUMENT NUMBER
- SHEET
- OF
- REV
- PCB DWG:

### Library data of the parts
BH1-BH3 = MOUNT_HOLE: MOUNTING HOLE DRILL 109 PAD 200 PLATED TH NO PART TO ORDER; Value: MOUNTING HOLE; PCB Footprint: GNDPOINT256; ROHS: Yes
C2 = CAP_NP: as C12 on sheet 09-PMIC QCMI SOM; Value: 2.2uF; PCB Footprint: 0402_CC; ROHS: Yes; Tolerance: 10%
C401 = CAP_NP: as C279 on sheet 09-PMIC QCMI SOM; Value: 10uF; ROHS: Yes; Tolerance: 10%; PCB Footprint: CC0603_OV
C402 = CAP_NP: as C281 on sheet 09-PMIC QCMI SOM; Value: 10uF; Tolerance: 10%; ROHS: Yes; PCB Footprint: CC0603_OV
C403 C404 = CAP_NP: as C275 on sheet 09-PMIC QCMI SOM; Value: 22uF; ROHS: Yes; Tolerance: 20%; PCB Footprint: CC0603_OV
J4 = HDR_2X50_M: CON 2X50 PLUG SHRD SMT 0.4MM SP 51H AU; MFG_NAME01: HIROSE; Temp Range: -35°C ~ 85°C; System: Connector; Value: DF40C-100DP-0.4V(51); PCB Footprint: con100_0p4_21p7x2p05_sm; MFG_PN01: DF40C-100DP-0.4V(51); ROHS: Yes
J5 = HDR_2X50_M: CON 2X50 SKT SHRD SMT 0.4MM SP 65H AU; MFG_NAME01: HIROSE; Temp Range: -35°C ~ 85°C; System: Connector; Value: DF40C-100DS-0.4V(51); PCB Footprint: con100_0p4_22p8x3p1_sm; ROHS: Yes; MFG_PN01: DF40C-100DS-0.4V(51)
J7 = CONN_HDR_10X2: CON 2X10 SKT SHRD SMT 0.4MM SP 63H AU; MFG_NAME01: HIROSE; Temp Range: -35°C ~ 85°C; System: Connector; Value: DF40C-20DS-0.4V(51); MFG_PN01: DF40C-20DS-0.4V(51); ROHS: Yes; PCB Footprint: con20_0p4_6p8x3p1_sm
J8 = CONN_HDR_12X2: CON 2X12 SKT SHRD SMT 0.4MM SP 65H AU; MFG_NAME01: HIROSE; System: Connector; Value: CON 2X12; PCB Footprint: con24_0p4_7p6x3p08_sm; ROHS: Yes
R116 = RES: RES MF ZERO OHM 1/16W 5% 0402; MFG_PN01: MCR01MZPJ000; MFG_NAME01: ROHM; EIA Case: 0402; Value: 0; ROHS: Yes; Tolerance: 5%; PCB Footprint: RC0402_25; Rated Power: 1/16W